# EAGLE schematic FRIDAY_Compute_SCH1 (EAGLE 9.6.2), part 1 of 2
Assembly variants: default

## Sheet 1 of 5: S1: Power Input (2S SY8205 + USB-C + TPS2121)
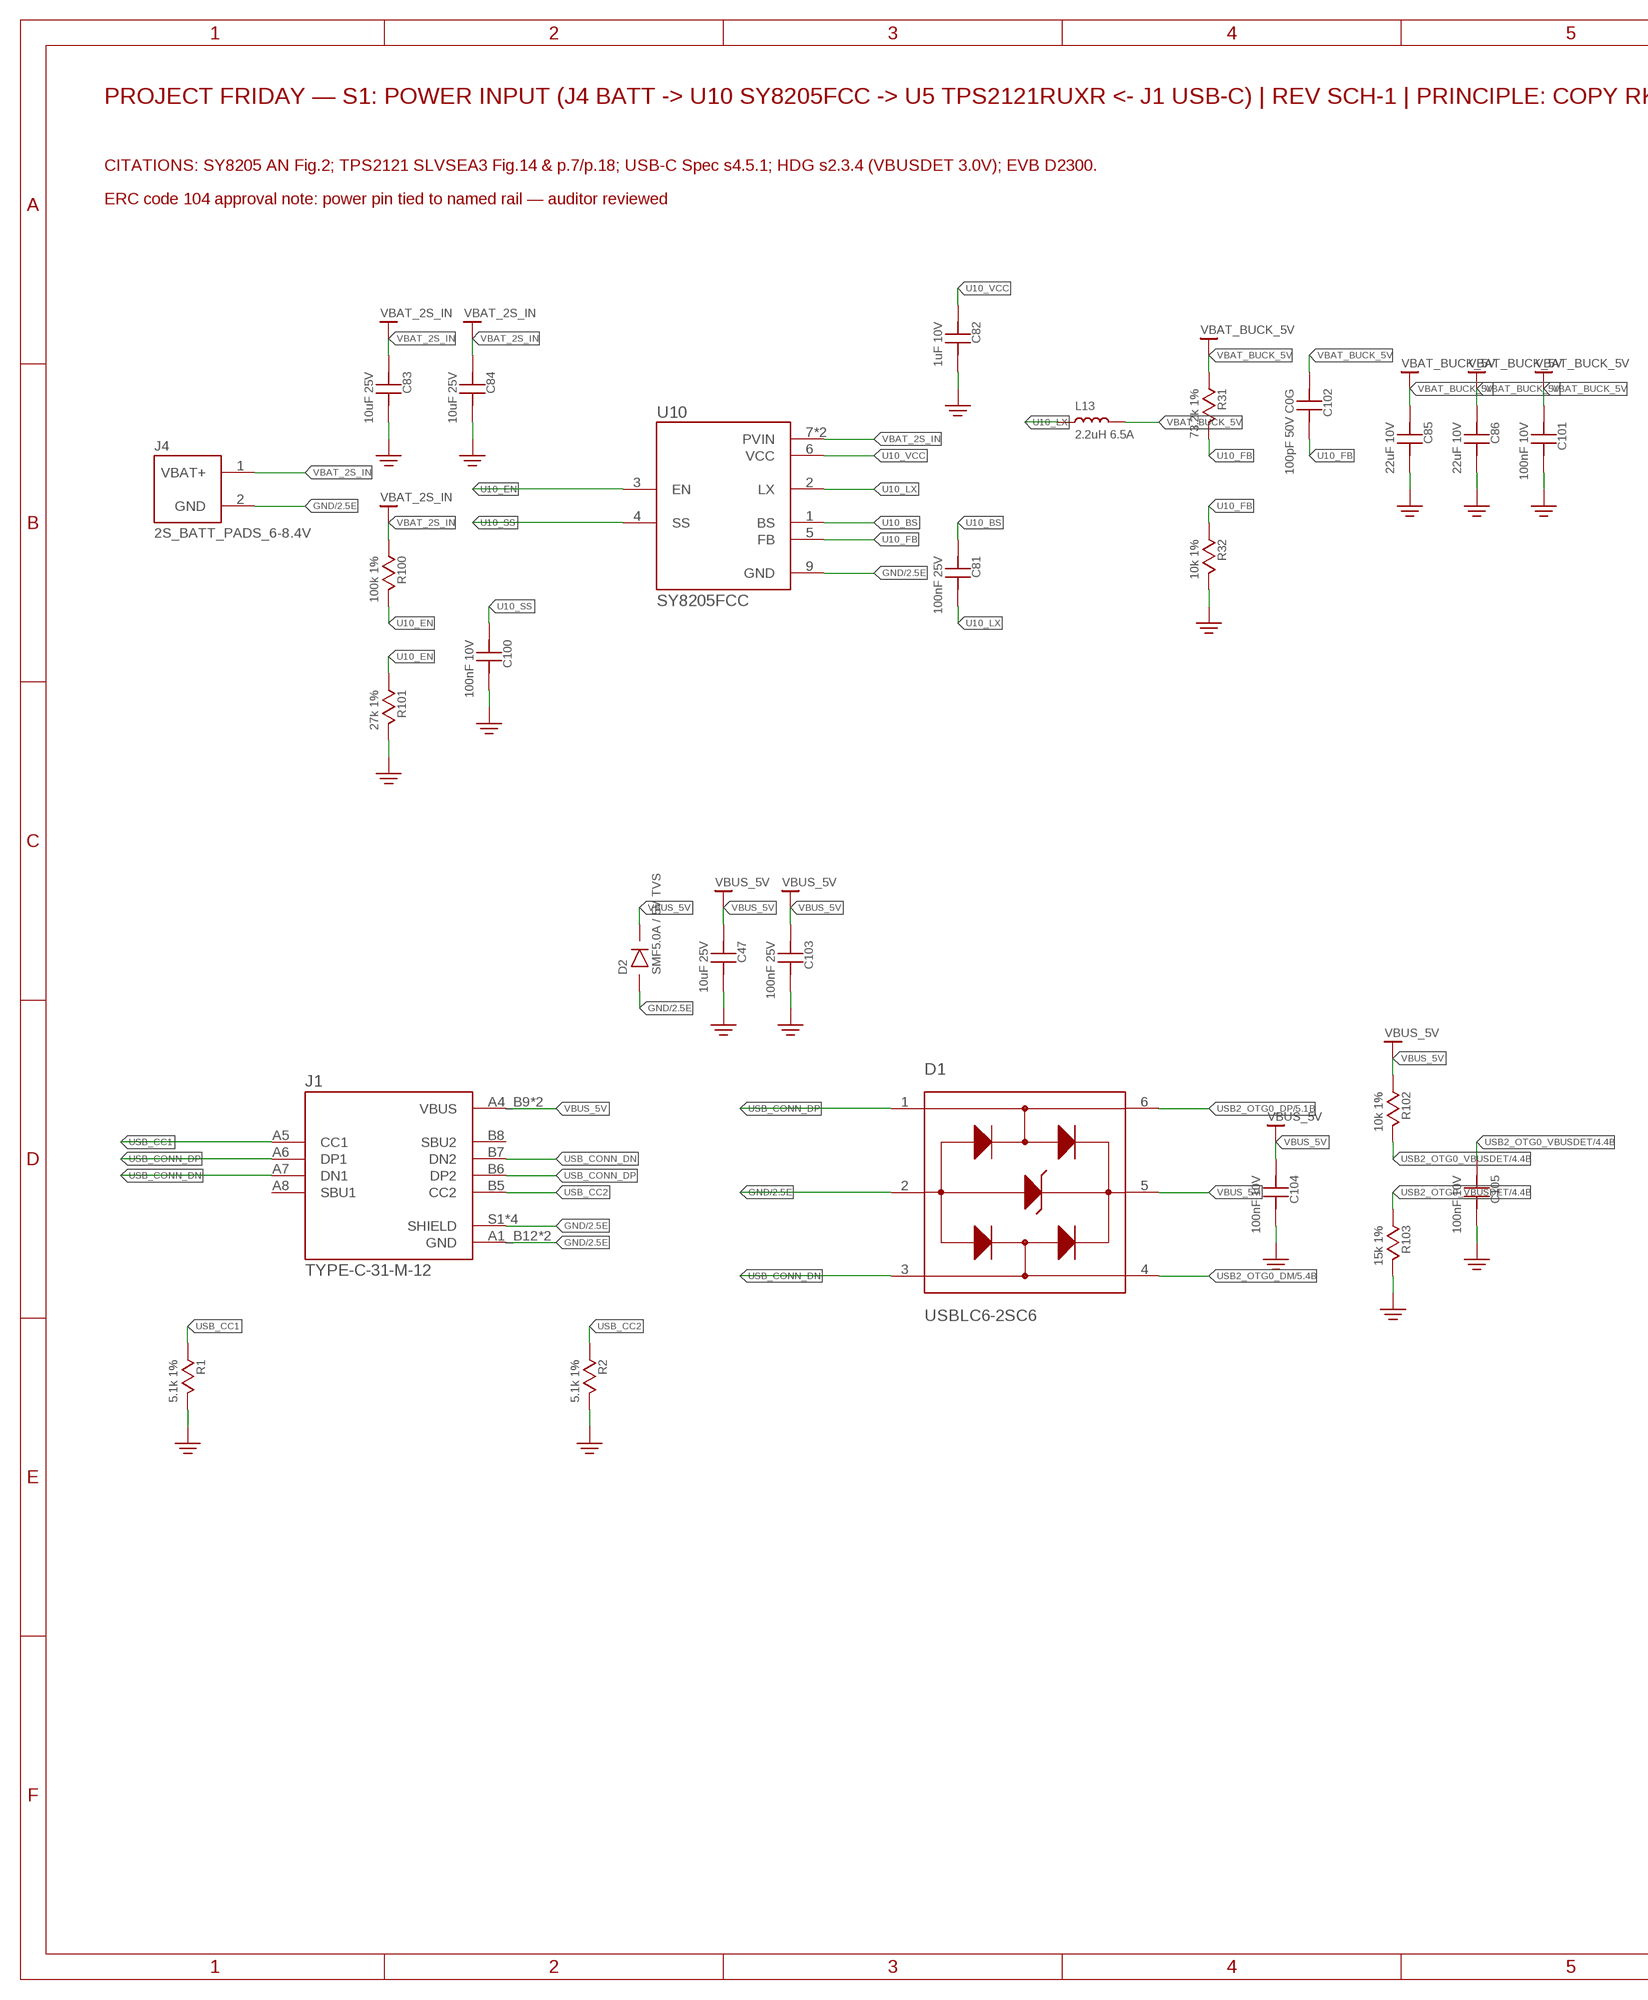
[diagram p0: schematic, sheet 1, part 1 of 2]
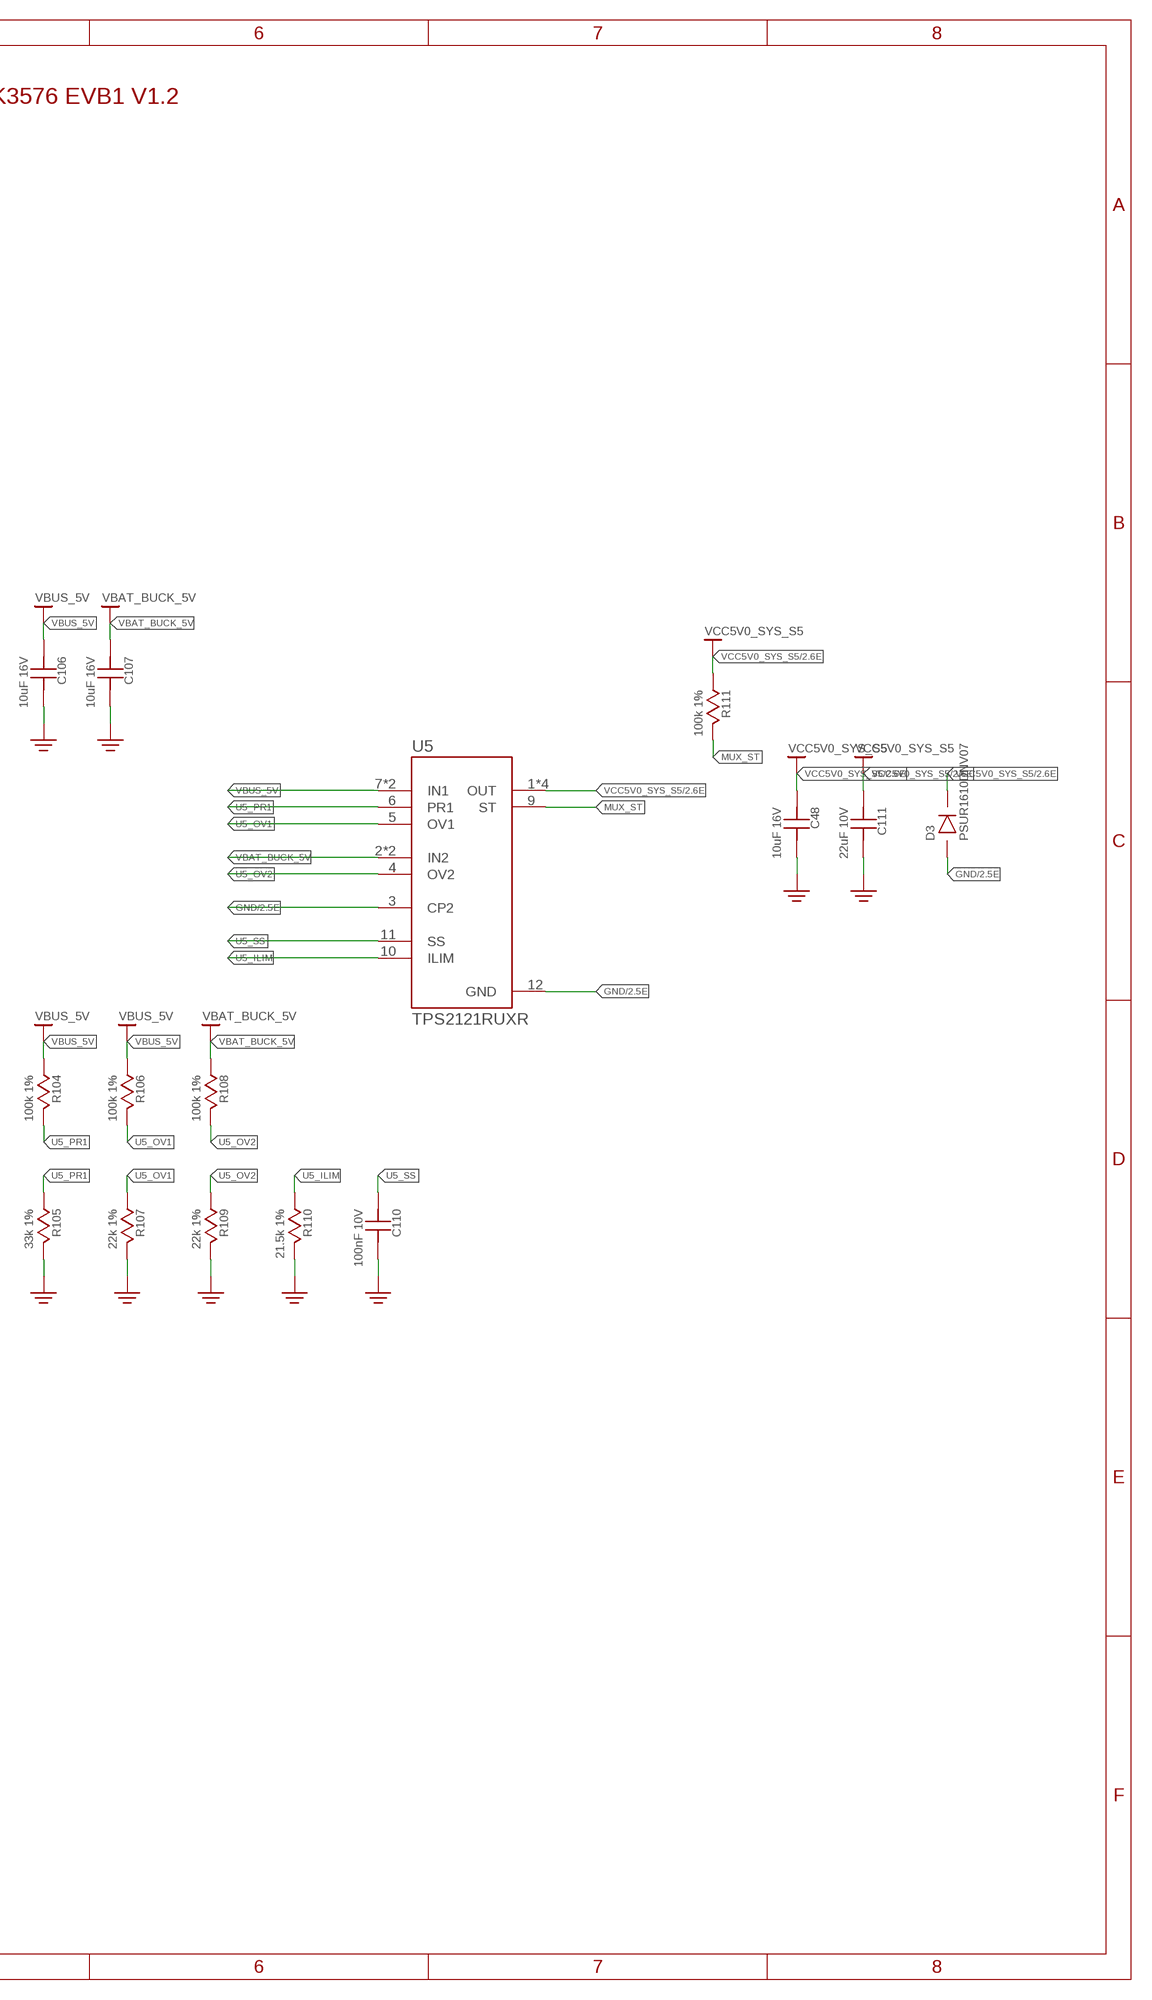
[diagram p1: schematic, sheet 1, part 2 of 2]

### Parts
C47  10uF 25V  C_0603  [C0603]
C48  10uF 16V  C_0603  [C0603]
C81  100nF 25V  C_0402  [C0402]
C82  1uF 10V  C_0402  [C0402]
C83  10uF 25V  C_0603  [C0603]
C84  10uF 25V  C_0603  [C0603]
C85  22uF 10V  C_0603  [C0603]
C86  22uF 10V  C_0603  [C0603]
C100  100nF 10V  C_0402  [C0402]
C101  100nF 10V  C_0402  [C0402]
C102  100pF 50V C0G  C_0402  [C0402]
C103  100nF 25V  C_0402  [C0402]
C104  100nF 10V  C_0402  [C0402]
C105  100nF 10V  C_0402  [C0402]
C106  10uF 16V  C_0603  [C0603]
C107  10uF 16V  C_0603  [C0603]
C110  100nF 10V  C_0402  [C0402]
C111  22uF 10V  C_0603  [C0603]
D1  USBLC6-2SC6  [SOT95P280X145-6N]
D2  SMF5.0A / 5V TVS  TVS_VBUS  [SOD-323]
D3  PSUR1610DNV07  [DFN1006-2]
J1  TYPE-C-31-M-12  [HRO_TYPE-C-31-M-12]
J4  2S_BATT_PADS_6-8.4V  BATT_PADS_2PIN  [BATT_PADS_2PIN]
L13  2.2uH 6.5A  IND_4040  [IND_4040]
PWR1  VBAT_2S_IN  (no package)
PWR3  VBAT_2S_IN  (no package)
PWR5  VBAT_2S_IN  (no package)
PWR9  VBAT_BUCK_5V  (no package)
PWR11  VBAT_BUCK_5V  (no package)
PWR13  VBAT_BUCK_5V  (no package)
PWR15  VBAT_BUCK_5V  (no package)
PWR19  VBUS_5V  (no package)
PWR21  VBUS_5V  (no package)
PWR23  VBUS_5V  (no package)
PWR25  VBUS_5V  (no package)
PWR28  VBUS_5V  (no package)
PWR30  VBAT_BUCK_5V  (no package)
PWR32  VBUS_5V  (no package)
PWR34  VBUS_5V  (no package)
PWR36  VBAT_BUCK_5V  (no package)
PWR40  VCC5V0_SYS_S5  (no package)
PWR41  VCC5V0_SYS_S5  (no package)
PWR43  VCC5V0_SYS_S5  (no package)
R1  5.1k 1%  R_0402  [R0402]
R2  5.1k 1%  R_0402  [R0402]
R31  73.2k 1%  R_0402  [R0402]
R32  10k 1%  R_0402  [R0402]
R100  100k 1%  R_0402  [R0402]
R101  27k 1%  R_0402  [R0402]
R102  10k 1%  R_0402  [R0402]
R103  15k 1%  R_0402  [R0402]
R104  100k 1%  R_0402  [R0402]
R105  33k 1%  R_0402  [R0402]
R106  100k 1%  R_0402  [R0402]
R107  22k 1%  R_0402  [R0402]
R108  100k 1%  R_0402  [R0402]
R109  22k 1%  R_0402  [R0402]
R110  21.5k 1%  R_0402  [R0402]
R111  100k 1%  R_0402  [R0402]
U5  TPS2121RUXR  [IC_TPS2121RUXR]
U10  SY8205FCC  [VREG_SY8205FCC]

### Nets
GND: C47.2 C48.2 C82.2 C83.2 C84.2 C85.2 C86.2 C100.2 C101.2 C103.2 C104.2 C105.2 C106.2 C107.2 C110.2 C111.2 D1.2(GND) D2.1 D3.1 J1.A1_B12(GND) J1.B1_A12(GND) J1.S1(SHIELD) J1.S2(SHIELD) J1.S3(SHIELD) J1.S4(SHIELD) J4.2(GND) R1.2 R2.2 R32.2 R101.2 R103.2 R105.2 R107.2 R109.2 R110.2 U5.3(CP2) U5.12(GND) U10.9(GND) ; also sheet 2,3,4,5
MUX_ST: R111.2 U5.9(ST)
U5_ILIM: R110.1 U5.10(ILIM)
U5_OV1: R106.2 R107.1 U5.5(OV1)
U5_OV2: R108.2 R109.1 U5.4(OV2)
U5_PR1: R104.2 R105.1 U5.6(PR1)
U5_SS: C110.1 U5.11(SS)
U10_BS: C81.1 U10.1(BS)
U10_EN: R100.2 R101.1 U10.3(EN)
U10_FB: C102.2 R31.2 R32.1 U10.5(FB)
U10_LX: C81.2 L13.1 U10.2(LX)
U10_SS: C100.1 U10.4(SS)
U10_VCC: C82.1 U10.6(VCC)
USB2_OTG0_DM: D1.4(I/O2_OUT) ; also sheet 5
USB2_OTG0_DP: D1.6(I/O1_OUT) ; also sheet 5
USB2_OTG0_VBUSDET: C105.1 R102.2 R103.1 ; also sheet 4
USB_CC1: J1.A5(CC1) R1.1
USB_CC2: J1.B5(CC2) R2.1
USB_CONN_DN: D1.3(I/O2_IN) J1.A7(DN1) J1.B7(DN2)
USB_CONN_DP: D1.1(I/O1_IN) J1.A6(DP1) J1.B6(DP2)
VBAT_2S_IN: C83.1 C84.1 J4.1(VBAT+) PWR1.VBAT_2S_IN PWR3.VBAT_2S_IN PWR5.VBAT_2S_IN R100.1 U10.7(PVIN) U10.8(PVIN)
VBAT_BUCK_5V: C85.1 C86.1 C101.1 C102.1 C107.1 L13.2 PWR9.VBAT_BUCK_5V PWR11.VBAT_BUCK_5V PWR13.VBAT_BUCK_5V PWR15.VBAT_BUCK_5V PWR30.VBAT_BUCK_5V PWR36.VBAT_BUCK_5V R31.1 R108.1 U5.2(IN2) U5.2_1(IN2)
VBUS_5V: C47.1 C103.1 C104.1 C106.1 D1.5(VBUS) D2.2 J1.A4_B9(VBUS) J1.B4_A9(VBUS) PWR19.VBUS_5V PWR21.VBUS_5V PWR23.VBUS_5V PWR25.VBUS_5V PWR28.VBUS_5V PWR32.VBUS_5V PWR34.VBUS_5V R102.1 R104.1 R106.1 U5.7(IN1) U5.7_1(IN1)
VCC5V0_SYS_S5: C48.1 C111.1 D3.2 PWR40.VCC5V0_SYS_S5 PWR41.VCC5V0_SYS_S5 PWR43.VCC5V0_SYS_S5 R111.1 U5.1(OUT) U5.1_1(OUT) U5.8(OUT) U5.8_1(OUT) ; also sheet 2,3
Unconnected: J1.A8(SBU1) J1.B8(SBU2)

### Notes on the sheet
- PROJECT FRIDAY — S1: POWER INPUT (J4 BATT -> U10 SY8205FCC -> U5 TPS2121RUXR <- J1 USB-C) | REV SCH-1 | PRINCIPLE: COPY RK3576 EVB1 V1.2
- CITATIONS: SY8205 AN Fig.2; TPS2121 SLVSEA3 Fig.14 & p.7/p.18; USB-C Spec s4.5.1; HDG s2.3.4 (VBUSDET 3.0V); EVB D2300.
- ERC code 104 approval note: power pin tied to named rail — auditor reviewed

## Sheet 2 of 5: S2: PMIC (U2 RK806S-5)
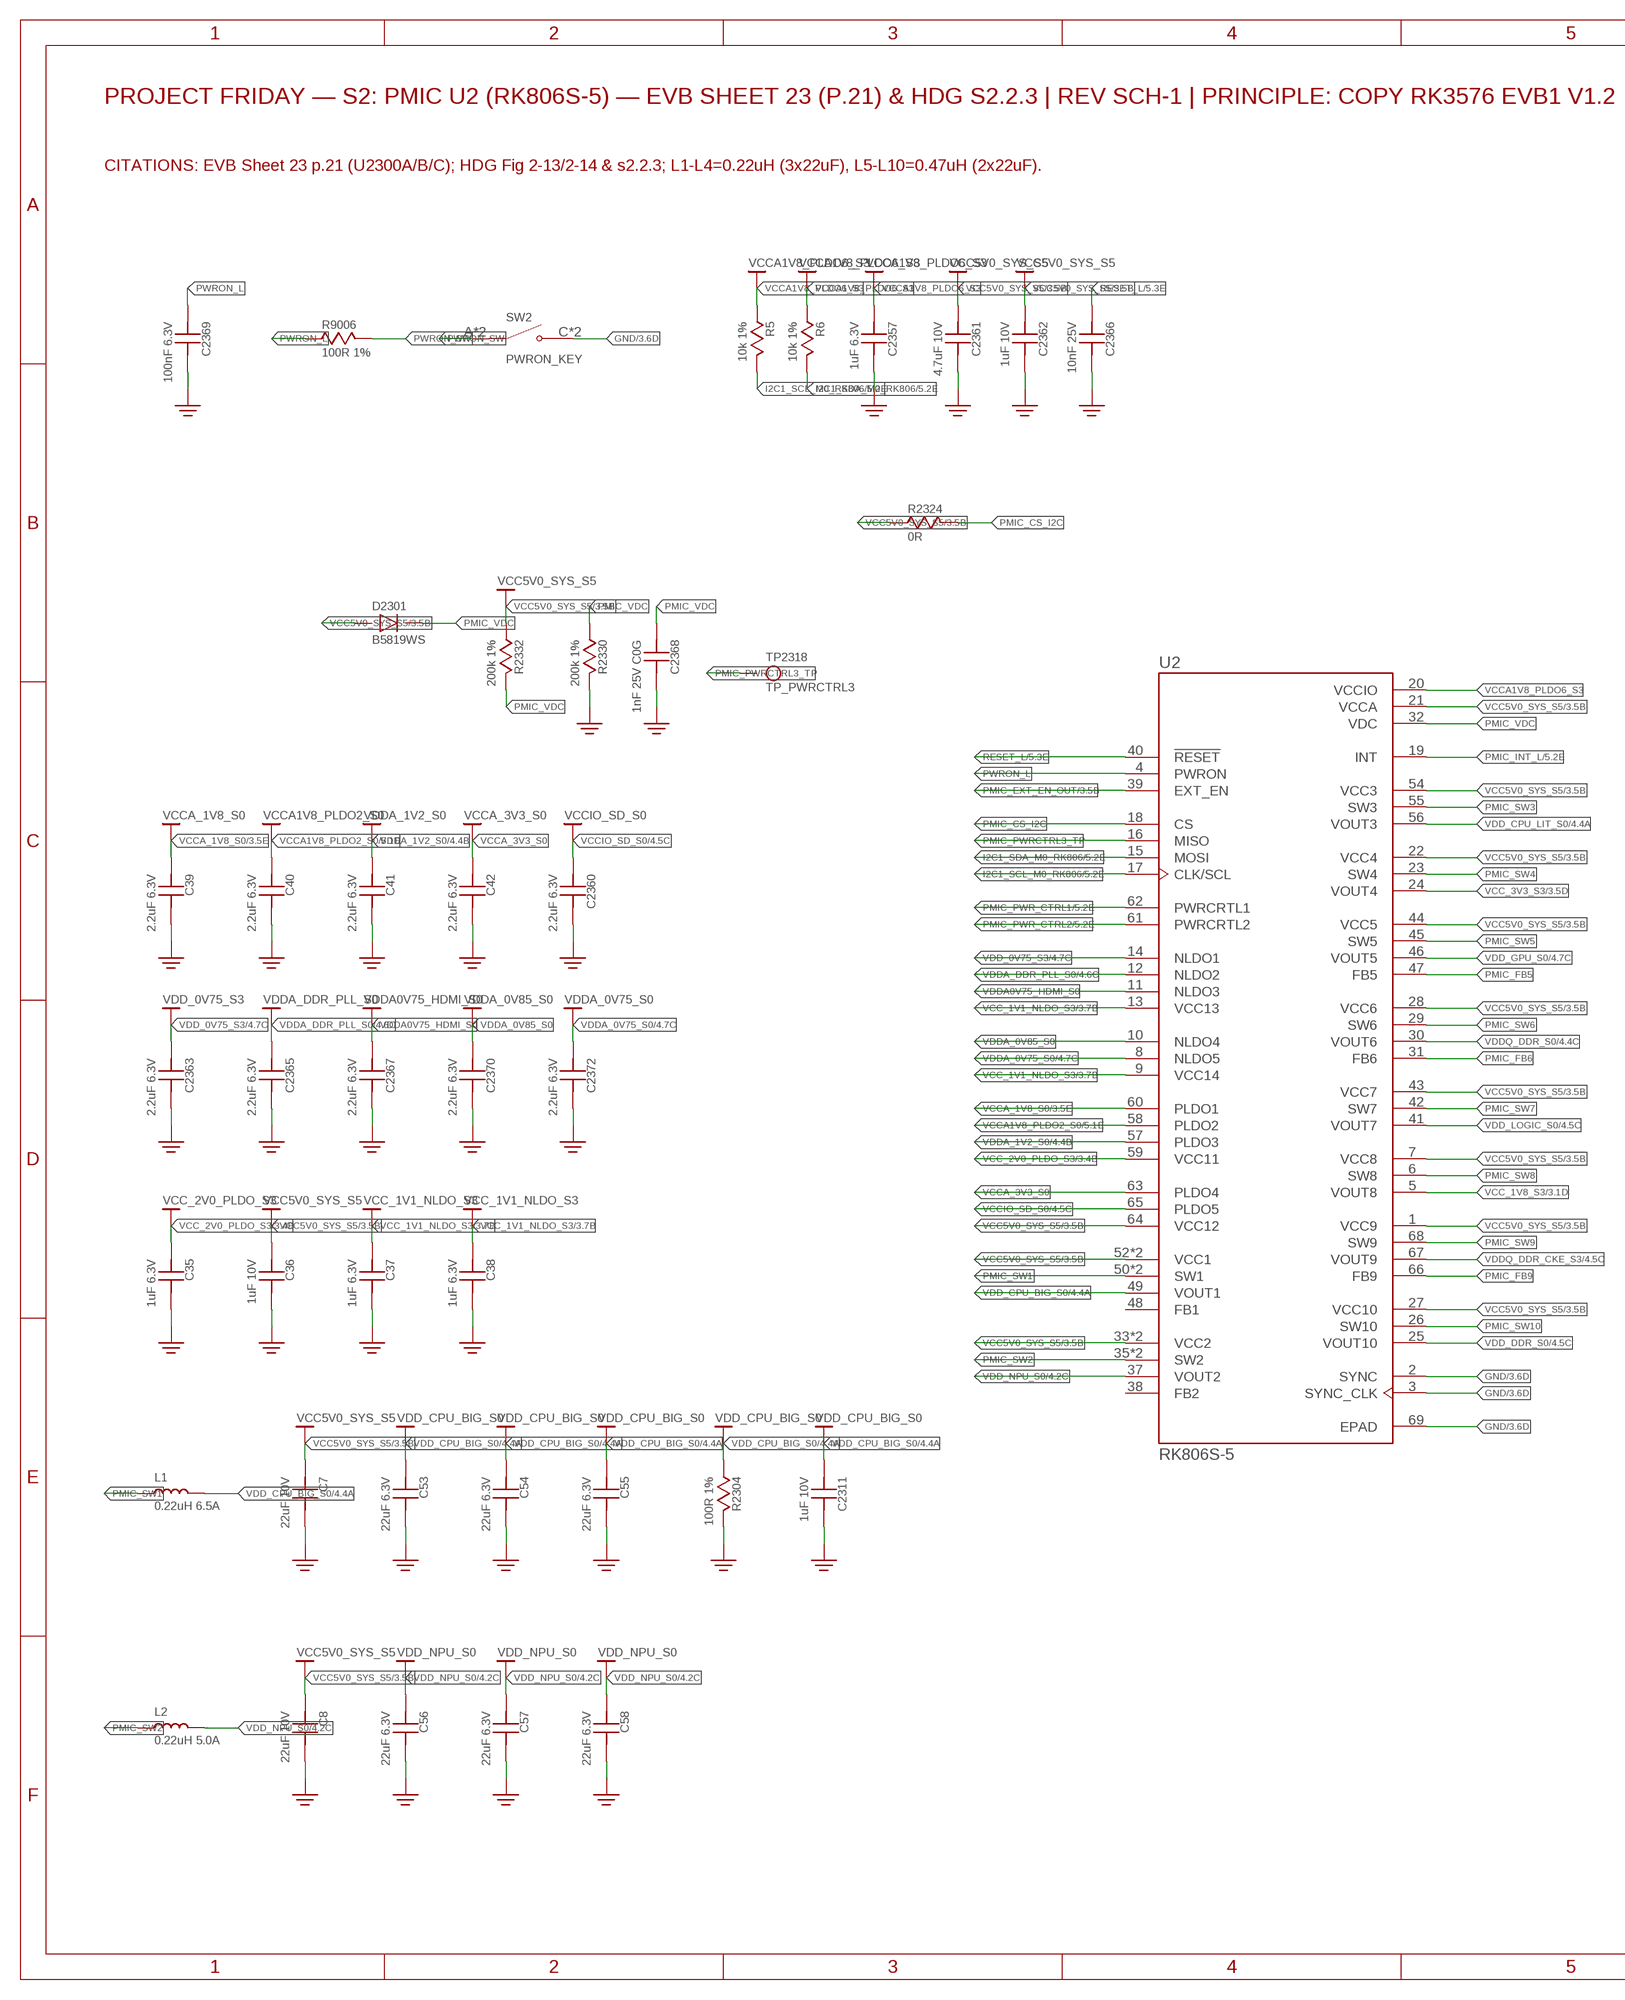
[diagram p2: schematic, sheet 2, part 1 of 2]
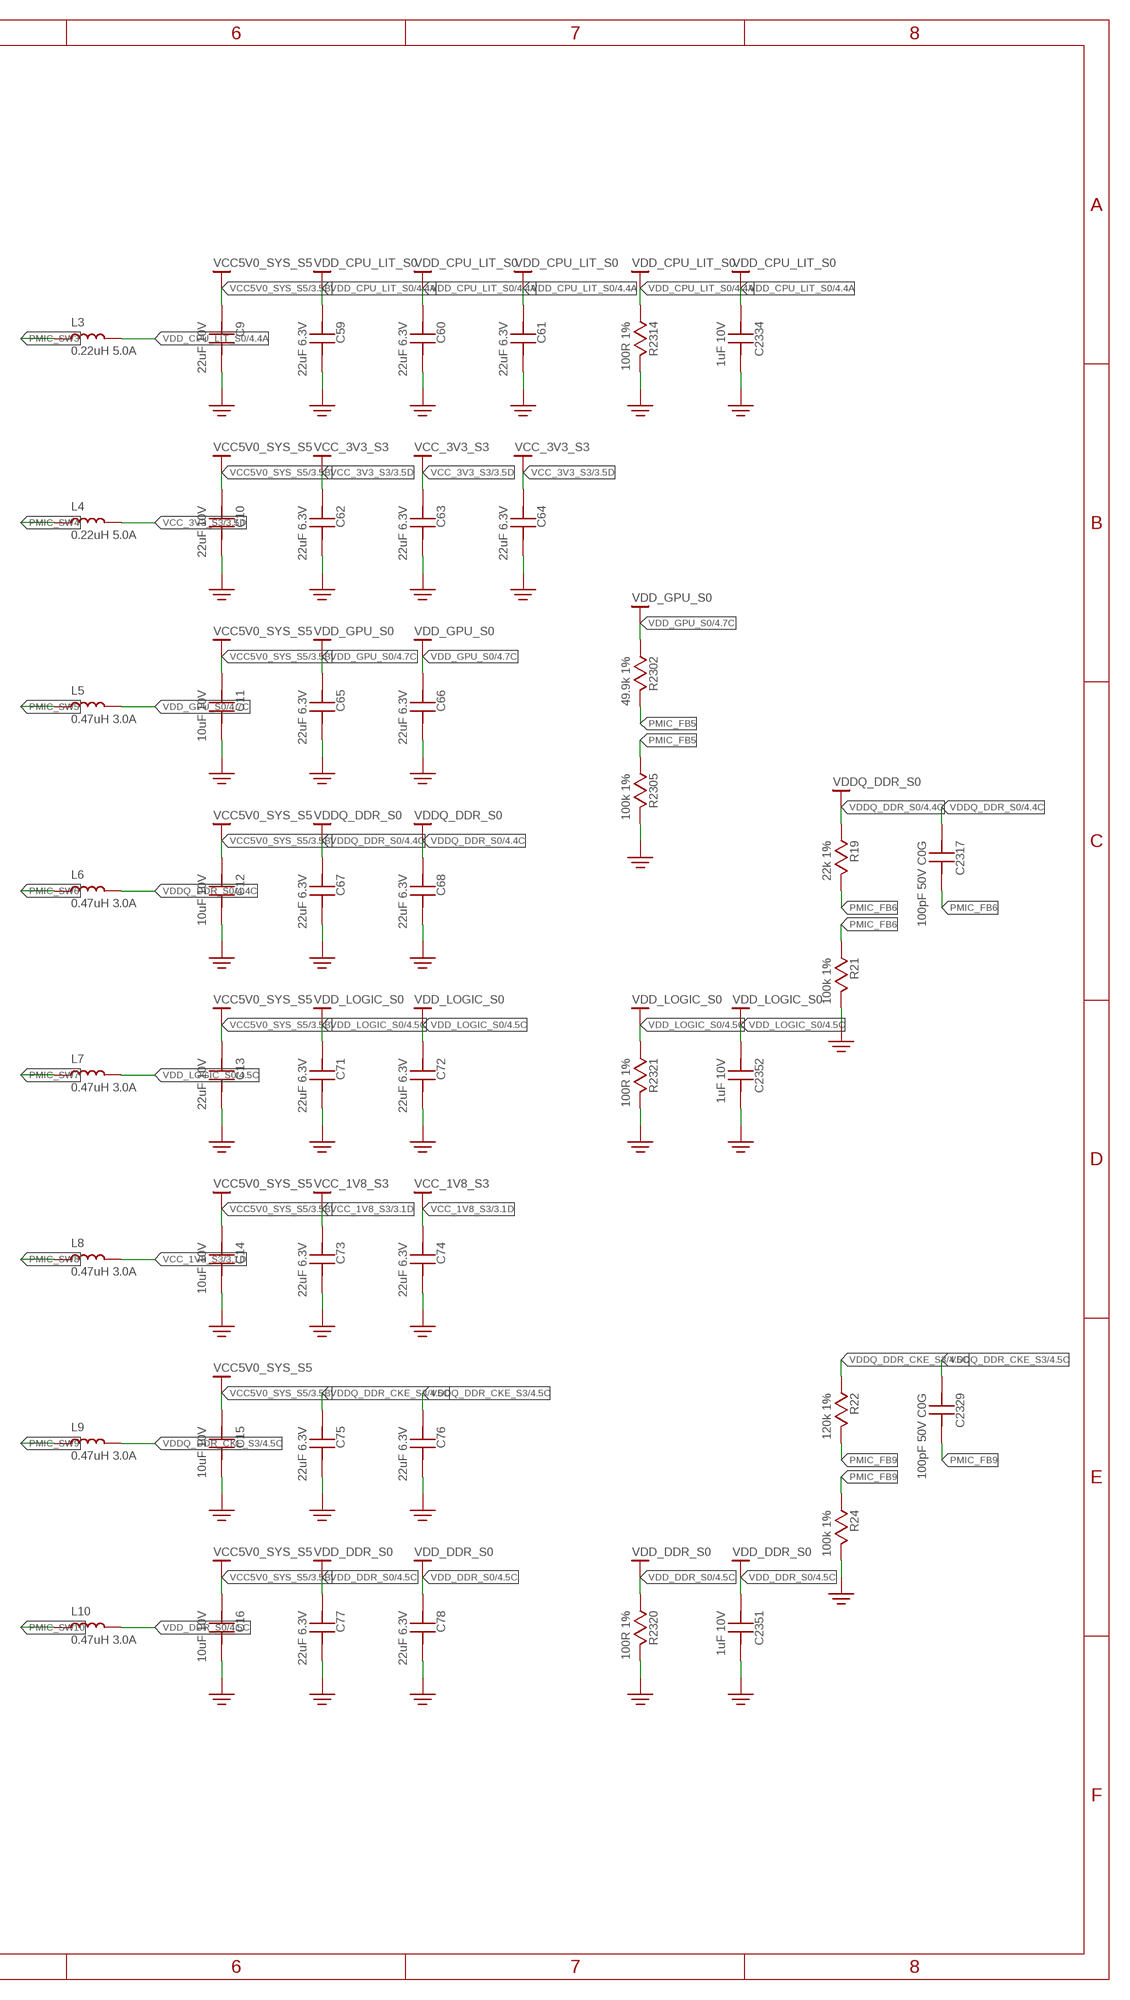
[diagram p3: schematic, sheet 2, part 2 of 2]

### Parts
C7  22uF 10V  C_0805  [C0805]
C8  22uF 10V  C_0805  [C0805]
C9  22uF 10V  C_0805  [C0805]
C10  22uF 10V  C_0805  [C0805]
C11  10uF 10V  C_0603  [C0603]
C12  10uF 10V  C_0603  [C0603]
C13  22uF 10V  C_0805  [C0805]
C14  10uF 10V  C_0603  [C0603]
C15  10uF 10V  C_0603  [C0603]
C16  10uF 10V  C_0603  [C0603]
C35  1uF 6.3V  C_0402  [C0402]
C36  1uF 10V  C_0402  [C0402]
C37  1uF 6.3V  C_0402  [C0402]
C38  1uF 6.3V  C_0402  [C0402]
C39  2.2uF 6.3V  C_0402  [C0402]
C40  2.2uF 6.3V  C_0402  [C0402]
C41  2.2uF 6.3V  C_0402  [C0402]
C42  2.2uF 6.3V  C_0402  [C0402]
C53  22uF 6.3V  C_0603  [C0603]
C54  22uF 6.3V  C_0603  [C0603]
C55  22uF 6.3V  C_0603  [C0603]
C56  22uF 6.3V  C_0603  [C0603]
C57  22uF 6.3V  C_0603  [C0603]
C58  22uF 6.3V  C_0603  [C0603]
C59  22uF 6.3V  C_0603  [C0603]
C60  22uF 6.3V  C_0603  [C0603]
C61  22uF 6.3V  C_0603  [C0603]
C62  22uF 6.3V  C_0603  [C0603]
C63  22uF 6.3V  C_0603  [C0603]
C64  22uF 6.3V  C_0603  [C0603]
C65  22uF 6.3V  C_0603  [C0603]
C66  22uF 6.3V  C_0603  [C0603]
C67  22uF 6.3V  C_0603  [C0603]
C68  22uF 6.3V  C_0603  [C0603]
C71  22uF 6.3V  C_0603  [C0603]
C72  22uF 6.3V  C_0603  [C0603]
C73  22uF 6.3V  C_0603  [C0603]
C74  22uF 6.3V  C_0603  [C0603]
C75  22uF 6.3V  C_0603  [C0603]
C76  22uF 6.3V  C_0603  [C0603]
C77  22uF 6.3V  C_0603  [C0603]
C78  22uF 6.3V  C_0603  [C0603]
C2311  1uF 10V  C_0402  [C0402]
C2317  100pF 50V C0G  C_0402  [C0402]
C2329  100pF 50V C0G  C_0402  [C0402]
C2334  1uF 10V  C_0402  [C0402]
C2351  1uF 10V  C_0402  [C0402]
C2352  1uF 10V  C_0402  [C0402]
C2357  1uF 6.3V  C_0402  [C0402]
C2360  2.2uF 6.3V  C_0402  [C0402]
C2361  4.7uF 10V  C_0402  [C0402]
C2362  1uF 10V  C_0402  [C0402]
C2363  2.2uF 6.3V  C_0402  [C0402]
C2365  2.2uF 6.3V  C_0402  [C0402]
C2366  10nF 25V  C_0402  [C0402]
C2367  2.2uF 6.3V  C_0402  [C0402]
C2368  1nF 25V C0G  C_0402  [C0402]
C2369  100nF 6.3V  C_0402  [C0402]
C2370  2.2uF 6.3V  C_0402  [C0402]
C2372  2.2uF 6.3V  C_0402  [C0402]
D2301  B5819WS  [SOD-323]
L1  0.22uH 6.5A  IND_2016  [IND_2016]
L2  0.22uH 5.0A  IND_2016  [IND_2016]
L3  0.22uH 5.0A  IND_2016  [IND_2016]
L4  0.22uH 5.0A  IND_2016  [IND_2016]
L5  0.47uH 3.0A  IND_2016  [IND_2016]
L6  0.47uH 3.0A  IND_2016  [IND_2016]
L7  0.47uH 3.0A  IND_2016  [IND_2016]
L8  0.47uH 3.0A  IND_2016  [IND_2016]
L9  0.47uH 3.0A  IND_2016  [IND_2016]
L10  0.47uH 3.0A  IND_2016  [IND_2016]
PWR45  VCC5V0_SYS_S5  (no package)
PWR47  VDD_CPU_BIG_S0  (no package)
PWR49  VDD_CPU_BIG_S0  (no package)
PWR51  VDD_CPU_BIG_S0  (no package)
PWR53  VDD_CPU_BIG_S0  (no package)
PWR55  VDD_CPU_BIG_S0  (no package)
PWR57  VCC5V0_SYS_S5  (no package)
PWR59  VDD_NPU_S0  (no package)
PWR61  VDD_NPU_S0  (no package)
PWR63  VDD_NPU_S0  (no package)
PWR65  VCC5V0_SYS_S5  (no package)
PWR67  VDD_CPU_LIT_S0  (no package)
PWR69  VDD_CPU_LIT_S0  (no package)
PWR71  VDD_CPU_LIT_S0  (no package)
PWR73  VDD_CPU_LIT_S0  (no package)
PWR75  VDD_CPU_LIT_S0  (no package)
PWR77  VCC5V0_SYS_S5  (no package)
PWR79  VCC_3V3_S3  (no package)
PWR81  VCC_3V3_S3  (no package)
PWR83  VCC_3V3_S3  (no package)
PWR85  VCC5V0_SYS_S5  (no package)
PWR87  VDD_GPU_S0  (no package)
PWR89  VDD_GPU_S0  (no package)
PWR91  VDD_GPU_S0  (no package)
PWR93  VCC5V0_SYS_S5  (no package)
PWR95  VDDQ_DDR_S0  (no package)
PWR97  VDDQ_DDR_S0  (no package)
PWR99  VDDQ_DDR_S0  (no package)
PWR101  VCC5V0_SYS_S5  (no package)
PWR103  VDD_LOGIC_S0  (no package)
PWR105  VDD_LOGIC_S0  (no package)
PWR107  VDD_LOGIC_S0  (no package)
PWR109  VDD_LOGIC_S0  (no package)
PWR111  VCC5V0_SYS_S5  (no package)
PWR113  VCC_1V8_S3  (no package)
PWR115  VCC_1V8_S3  (no package)
PWR117  VCC5V0_SYS_S5  (no package)
PWR125  VCC5V0_SYS_S5  (no package)
PWR127  VDD_DDR_S0  (no package)
PWR129  VDD_DDR_S0  (no package)
PWR131  VDD_DDR_S0  (no package)
PWR133  VDD_DDR_S0  (no package)
PWR135  VCC_2V0_PLDO_S3  (no package)
PWR137  VCC5V0_SYS_S5  (no package)
PWR139  VCC_1V1_NLDO_S3  (no package)
PWR141  VCC_1V1_NLDO_S3  (no package)
PWR143  VCCA_1V8_S0  (no package)
PWR145  VCCA1V8_PLDO2_S0  (no package)
PWR147  VDDA_1V2_S0  (no package)
PWR149  VCCA_3V3_S0  (no package)
PWR151  VCCIO_SD_S0  (no package)
PWR153  VDD_0V75_S3  (no package)
PWR155  VDDA_DDR_PLL_S0  (no package)
PWR157  VDDA0V75_HDMI_S0  (no package)
PWR159  VDDA_0V85_S0  (no package)
PWR161  VDDA_0V75_S0  (no package)
PWR163  VCCA1V8_PLDO6_S3  (no package)
PWR165  VCC5V0_SYS_S5  (no package)
PWR167  VCC5V0_SYS_S5  (no package)
PWR169  VCCA1V8_PLDO6_S3  (no package)
PWR170  VCCA1V8_PLDO6_S3  (no package)
PWR173  VCC5V0_SYS_S5  (no package)
R5  10k 1%  R_0402  [R0402]
R6  10k 1%  R_0402  [R0402]
R19  22k 1%  R_0402  [R0402]
R21  100k 1%  R_0402  [R0402]
R22  120k 1%  R_0402  [R0402]
R24  100k 1%  R_0402  [R0402]
R2302  49.9k 1%  R_0402  [R0402]
R2304  100R 1%  R_0402  [R0402]
R2305  100k 1%  R_0402  [R0402]
R2314  100R 1%  R_0402  [R0402]
R2320  100R 1%  R_0402  [R0402]
R2321  100R 1%  R_0402  [R0402]
R2324  0R  R_0402  [R0402]
R2330  200k 1%  R_0402  [R0402]
R2332  200k 1%  R_0402  [R0402]
R9006  100R 1%  R_0402  [R0402]
SW2  PWRON_KEY  TS-1187A-B-A-B  [SW_TS-1187A-B-A-B]
TP2318  TP_PWRCTRL3  TP_1MM  [TP_1MM]
U2  RK806S-5  RK806-1  [QFN35P700X700X90-69N]

### Nets
GND: C7.2 C8.2 C9.2 C10.2 C11.2 C12.2 C13.2 C14.2 C15.2 C16.2 C35.2 C36.2 C37.2 C38.2 C39.2 C40.2 C41.2 C42.2 C53.2 C54.2 C55.2 C56.2 C57.2 C58.2 C59.2 C60.2 C61.2 C62.2 C63.2 C64.2 C65.2 C66.2 C67.2 C68.2 C71.2 C72.2 C73.2 C74.2 C75.2 C76.2 C77.2 C78.2 C2311.2 C2334.2 C2351.2 C2352.2 C2357.2 C2360.2 C2361.2 C2362.2 C2363.2 C2365.2 C2366.2 C2367.2 C2368.2 C2369.2 C2370.2 C2372.2 R21.2 R24.2 R2304.2 R2305.2 R2314.2 R2320.2 R2321.2 R2330.2 SW2.C(NO) SW2.D(NO) U2.2(SYNC) U2.3(SYNC_CLK) U2.69(EPAD) ; also sheet 1,3,4,5
I2C1_SCL_M0_RK806: R5.2 U2.17(CLK/SCL) ; also sheet 5
I2C1_SDA_M0_RK806: R6.2 U2.15(MOSI) ; also sheet 5
PMIC_CS_I2C: R2324.2 U2.18(CS)
PMIC_EXT_EN_OUT: U2.39(EXT_EN) ; also sheet 3
PMIC_FB5: R2302.2 R2305.1 U2.47(FB5)
PMIC_FB6: C2317.2 R19.2 R21.1 U2.31(FB6)
PMIC_FB9: C2329.2 R22.2 R24.1 U2.66(FB9)
PMIC_INT_L: U2.19(INT) ; also sheet 5
PMIC_PWR_CTRL1: U2.62(PWRCRTL1) ; also sheet 5
PMIC_PWR_CTRL2: U2.61(PWRCRTL2) ; also sheet 5
PMIC_PWRCTRL3_TP: TP2318.1 U2.16(MISO)
PMIC_SW1: L1.1 U2.50(SW1) U2.51(SW1)
PMIC_SW2: L2.1 U2.35(SW2) U2.36(SW2)
PMIC_SW3: L3.1 U2.55(SW3)
PMIC_SW4: L4.1 U2.23(SW4)
PMIC_SW5: L5.1 U2.45(SW5)
PMIC_SW6: L6.1 U2.29(SW6)
PMIC_SW7: L7.1 U2.42(SW7)
PMIC_SW8: L8.1 U2.6(SW8)
PMIC_SW9: L9.1 U2.68(SW9)
PMIC_SW10: L10.1 U2.26(SW10)
PMIC_VDC: C2368.1 D2301.2 R2330.1 R2332.2 U2.32(VDC)
PWRON_L: C2369.1 R9006.1 U2.4(PWRON)
PWRON_SW: R9006.2 SW2.A(COM) SW2.B(COM)
RESET_L: C2366.1 U2.40(!RESET) ; also sheet 5
VCC5V0_SYS_S5: C7.1 C8.1 C9.1 C10.1 C11.1 C12.1 C13.1 C14.1 C15.1 C16.1 C36.1 C2361.1 C2362.1 D2301.1 PWR45.VCC5V0_SYS_S5 PWR57.VCC5V0_SYS_S5 PWR65.VCC5V0_SYS_S5 PWR77.VCC5V0_SYS_S5 PWR85.VCC5V0_SYS_S5 PWR93.VCC5V0_SYS_S5 PWR101.VCC5V0_SYS_S5 PWR111.VCC5V0_SYS_S5 PWR117.VCC5V0_SYS_S5 PWR125.VCC5V0_SYS_S5 PWR137.VCC5V0_SYS_S5 PWR165.VCC5V0_SYS_S5 PWR167.VCC5V0_SYS_S5 PWR173.VCC5V0_SYS_S5 R2324.1 R2332.1 U2.1(VCC9) U2.7(VCC8) U2.21(VCCA) U2.22(VCC4) U2.27(VCC10) U2.28(VCC6) U2.33(VCC2) U2.34(VCC2) U2.43(VCC7) U2.44(VCC5) U2.52(VCC1) U2.53(VCC1) U2.54(VCC3) U2.64(VCC12) ; also sheet 1,3
VCC_1V1_NLDO_S3: C37.1 C38.1 PWR139.VCC_1V1_NLDO_S3 PWR141.VCC_1V1_NLDO_S3 U2.9(VCC14) U2.13(VCC13) ; also sheet 3
VCC_1V8_S3: C73.1 C74.1 L8.2 PWR113.VCC_1V8_S3 PWR115.VCC_1V8_S3 U2.5(VOUT8) ; also sheet 3,4,5
VCC_2V0_PLDO_S3: C35.1 PWR135.VCC_2V0_PLDO_S3 U2.59(VCC11) ; also sheet 3
VCC_3V3_S3: C62.1 C63.1 C64.1 L4.2 PWR79.VCC_3V3_S3 PWR81.VCC_3V3_S3 PWR83.VCC_3V3_S3 U2.24(VOUT4) ; also sheet 3,4,5
VCCA1V8_PLDO2_S0: C40.1 PWR145.VCCA1V8_PLDO2_S0 U2.58(PLDO2) ; also sheet 5
VCCA1V8_PLDO6_S3: C2357.1 PWR163.VCCA1V8_PLDO6_S3 PWR169.VCCA1V8_PLDO6_S3 PWR170.VCCA1V8_PLDO6_S3 R5.1 R6.1 U2.20(VCCIO)
VCCA_1V8_S0: C39.1 PWR143.VCCA_1V8_S0 U2.60(PLDO1) ; also sheet 3,4,5
VCCA_3V3_S0: C42.1 PWR149.VCCA_3V3_S0 U2.63(PLDO4)
VCCIO_SD_S0: C2360.1 PWR151.VCCIO_SD_S0 U2.65(PLDO5) ; also sheet 4
VDD_0V75_S3: C2363.1 PWR153.VDD_0V75_S3 U2.14(NLDO1) ; also sheet 4
VDD_CPU_BIG_S0: C53.1 C54.1 C55.1 C2311.1 L1.2 PWR47.VDD_CPU_BIG_S0 PWR49.VDD_CPU_BIG_S0 PWR51.VDD_CPU_BIG_S0 PWR53.VDD_CPU_BIG_S0 PWR55.VDD_CPU_BIG_S0 R2304.1 U2.49(VOUT1) ; also sheet 4
VDD_CPU_LIT_S0: C59.1 C60.1 C61.1 C2334.1 L3.2 PWR67.VDD_CPU_LIT_S0 PWR69.VDD_CPU_LIT_S0 PWR71.VDD_CPU_LIT_S0 PWR73.VDD_CPU_LIT_S0 PWR75.VDD_CPU_LIT_S0 R2314.1 U2.56(VOUT3) ; also sheet 4
VDD_DDR_S0: C77.1 C78.1 C2351.1 L10.2 PWR127.VDD_DDR_S0 PWR129.VDD_DDR_S0 PWR131.VDD_DDR_S0 PWR133.VDD_DDR_S0 R2320.1 U2.25(VOUT10) ; also sheet 4
VDD_GPU_S0: C65.1 C66.1 L5.2 PWR87.VDD_GPU_S0 PWR89.VDD_GPU_S0 PWR91.VDD_GPU_S0 R2302.1 U2.46(VOUT5) ; also sheet 4
VDD_LOGIC_S0: C71.1 C72.1 C2352.1 L7.2 PWR103.VDD_LOGIC_S0 PWR105.VDD_LOGIC_S0 PWR107.VDD_LOGIC_S0 PWR109.VDD_LOGIC_S0 R2321.1 U2.41(VOUT7) ; also sheet 4
VDD_NPU_S0: C56.1 C57.1 C58.1 L2.2 PWR59.VDD_NPU_S0 PWR61.VDD_NPU_S0 PWR63.VDD_NPU_S0 U2.37(VOUT2) ; also sheet 4
VDDA0V75_HDMI_S0: C2367.1 PWR157.VDDA0V75_HDMI_S0 U2.11(NLDO3)
VDDA_0V75_S0: C2372.1 PWR161.VDDA_0V75_S0 U2.8(NLDO5) ; also sheet 4
VDDA_0V85_S0: C2370.1 PWR159.VDDA_0V85_S0 U2.10(NLDO4) ; also sheet 4
VDDA_1V2_S0: C41.1 PWR147.VDDA_1V2_S0 U2.57(PLDO3) ; also sheet 4
VDDA_DDR_PLL_S0: C2365.1 PWR155.VDDA_DDR_PLL_S0 U2.12(NLDO2) ; also sheet 4
VDDQ_DDR_CKE_S3: C75.1 C76.1 C2329.1 L9.2 R22.1 U2.67(VOUT9) ; also sheet 4
VDDQ_DDR_S0: C67.1 C68.1 C2317.1 L6.2 PWR95.VDDQ_DDR_S0 PWR97.VDDQ_DDR_S0 PWR99.VDDQ_DDR_S0 R19.1 U2.30(VOUT6) ; also sheet 4
Unconnected: U2.38(FB2) U2.48(FB1)

### Notes on the sheet
- PROJECT FRIDAY — S2: PMIC U2 (RK806S-5) — EVB SHEET 23 (P.21) & HDG S2.2.3 | REV SCH-1 | PRINCIPLE: COPY RK3576 EVB1 V1.2
- CITATIONS: EVB Sheet 23 p.21 (U2300A/B/C); HDG Fig 2-13/2-14 & s2.2.3; L1-L4=0.22uH (3x22uF), L5-L10=0.47uH (2x22uF).

## Sheet 3 of 5: S3: Discrete Power (U6/U7 TMI3112H, U8 SY6280, U9 CW3301)
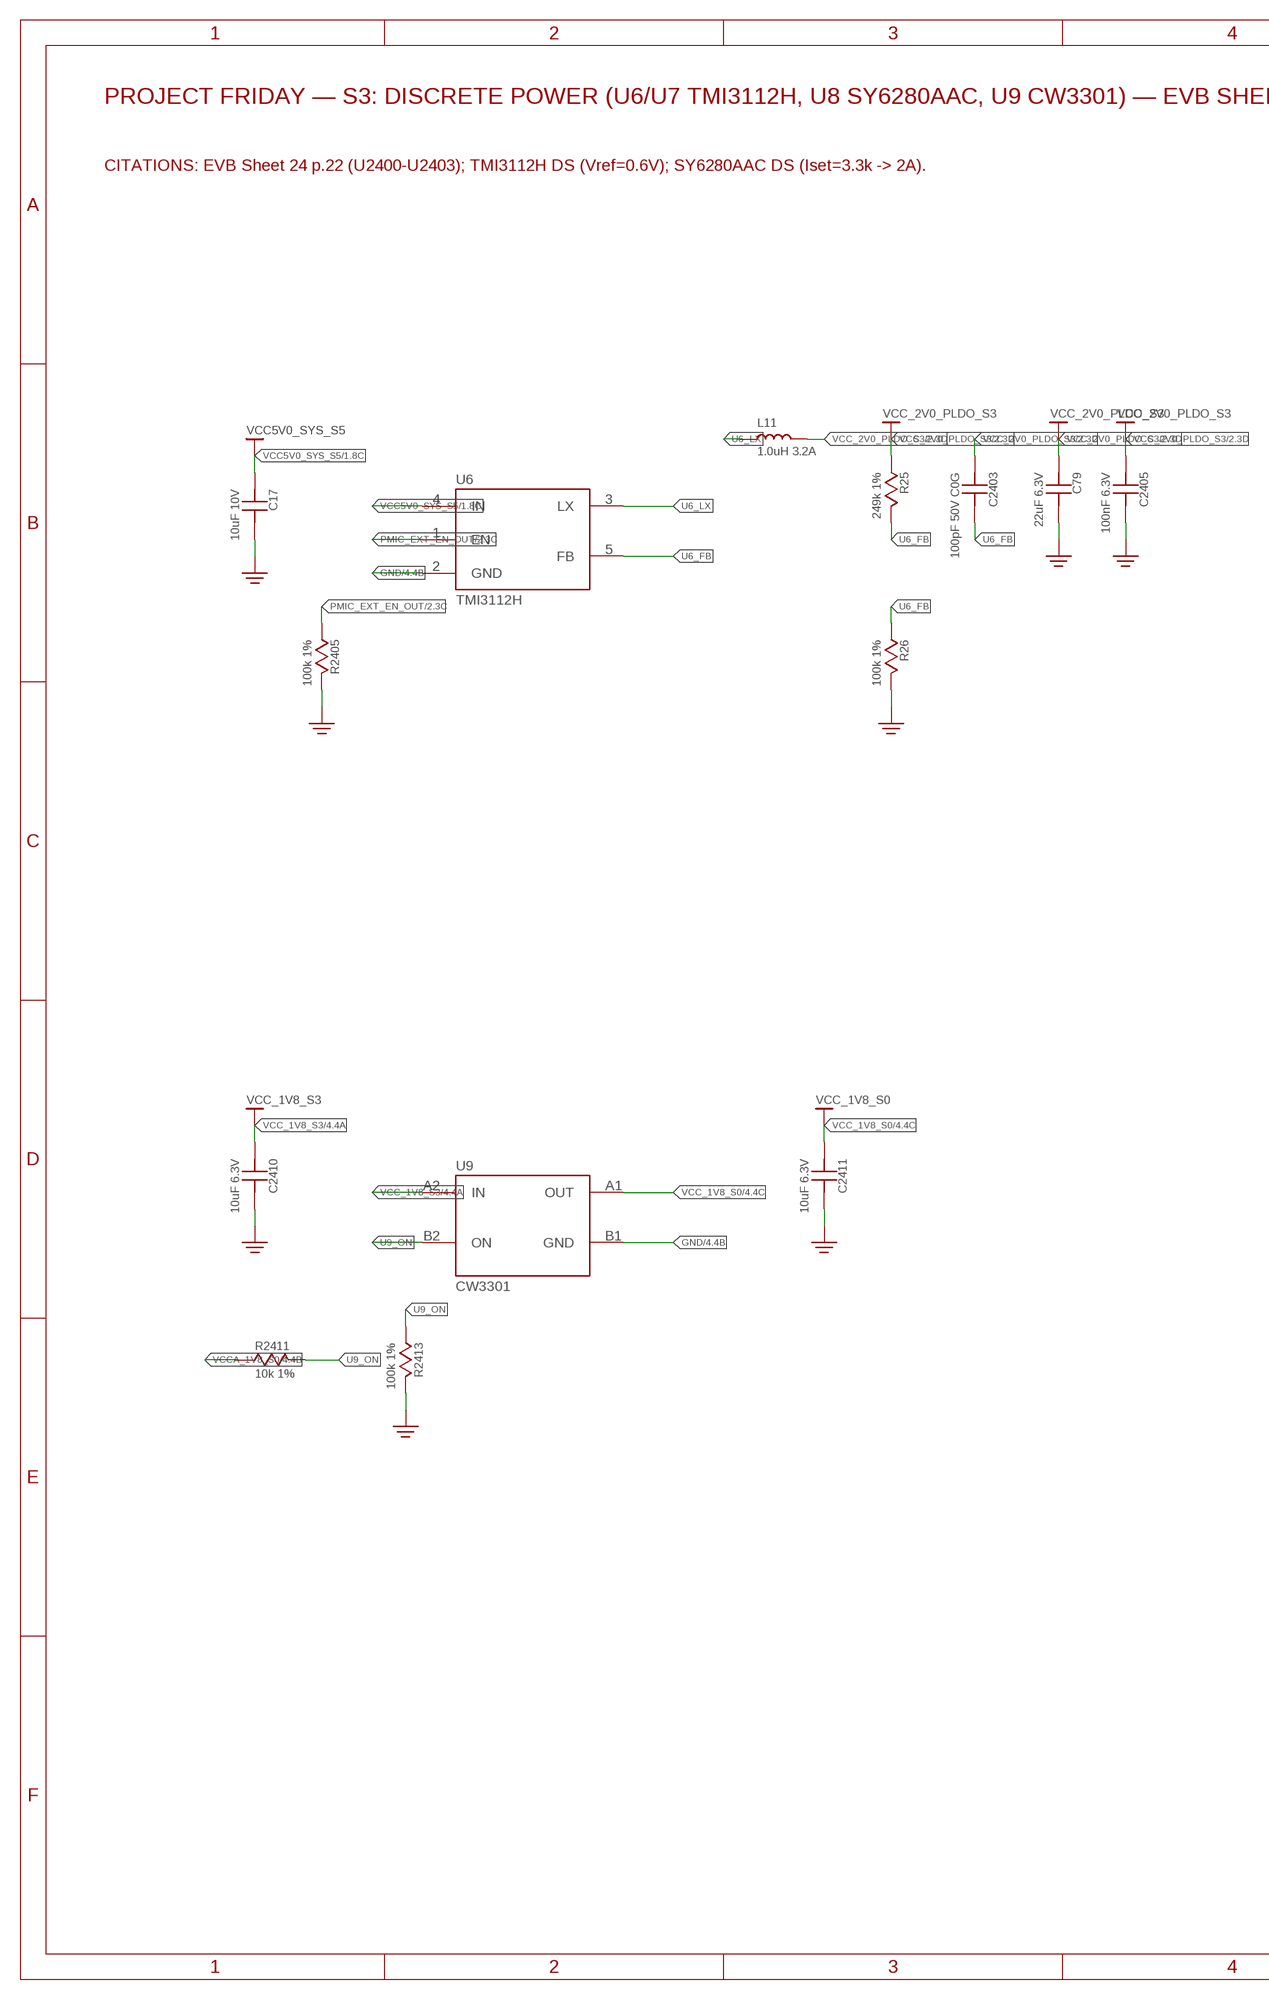
[diagram p4: schematic, sheet 3, part 1 of 2]
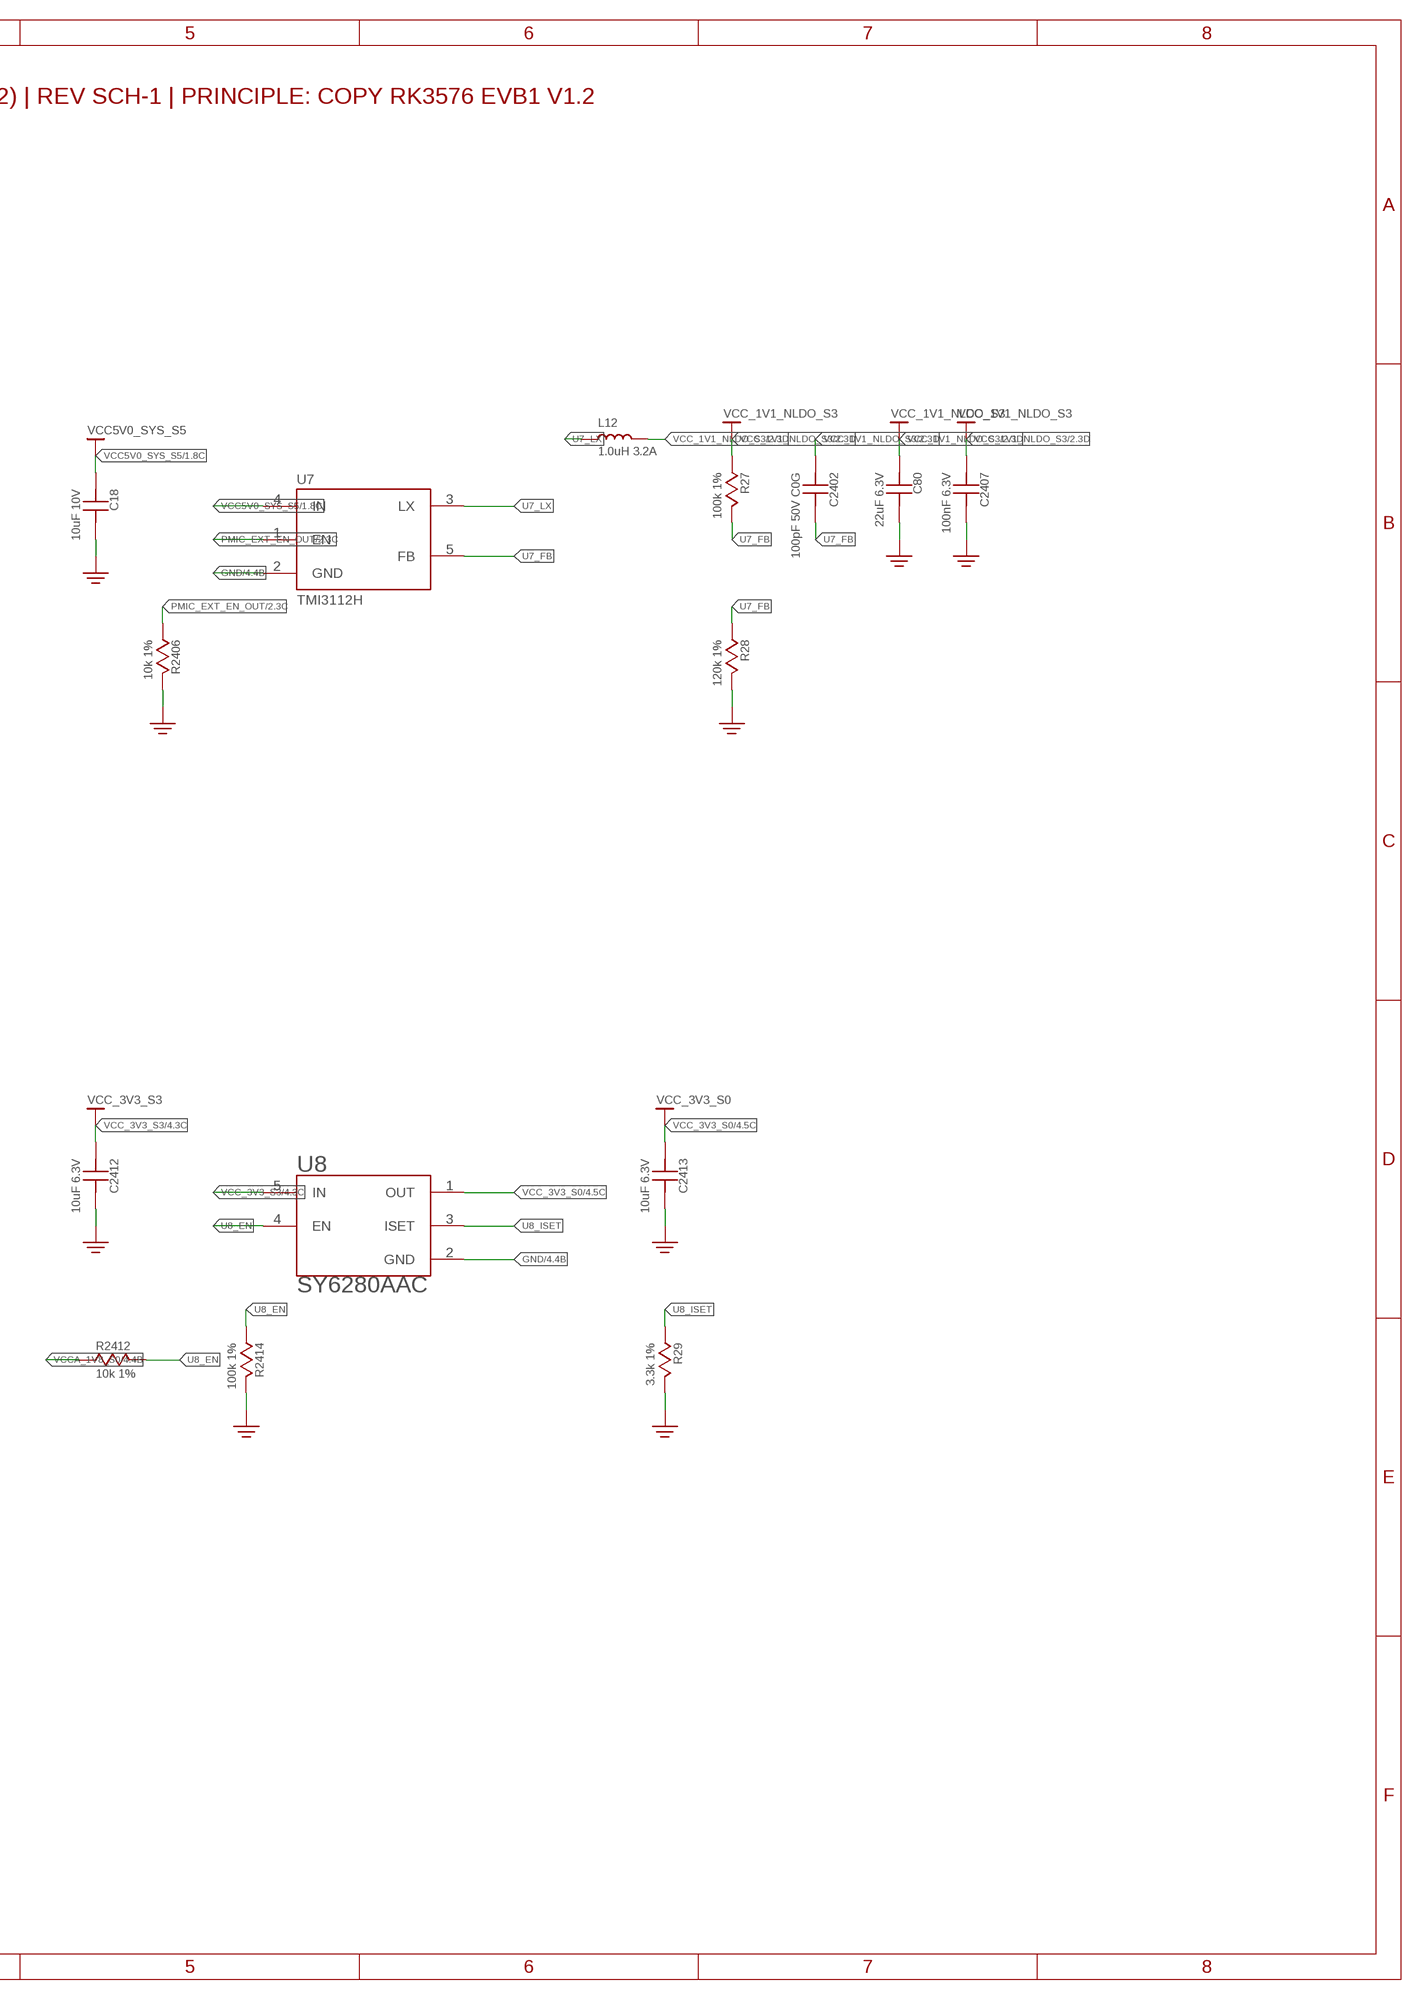
[diagram p5: schematic, sheet 3, part 2 of 2]

### Parts
C17  10uF 10V  C_0603  [C0603]
C18  10uF 10V  C_0603  [C0603]
C79  22uF 6.3V  C_0603  [C0603]
C80  22uF 6.3V  C_0603  [C0603]
C2402  100pF 50V C0G  C_0402  [C0402]
C2403  100pF 50V C0G  C_0402  [C0402]
C2405  100nF 6.3V  C_0402  [C0402]
C2407  100nF 6.3V  C_0402  [C0402]
C2410  10uF 6.3V  C_0603  [C0603]
C2411  10uF 6.3V  C_0603  [C0603]
C2412  10uF 6.3V  C_0603  [C0603]
C2413  10uF 6.3V  C_0603  [C0603]
L11  1.0uH 3.2A  IND_2520  [IND_2520]
L12  1.0uH 3.2A  IND_2520  [IND_2520]
PWR176  VCC5V0_SYS_S5  (no package)
PWR179  VCC_2V0_PLDO_S3  (no package)
PWR181  VCC_2V0_PLDO_S3  (no package)
PWR183  VCC_2V0_PLDO_S3  (no package)
PWR185  VCC5V0_SYS_S5  (no package)
PWR188  VCC_1V1_NLDO_S3  (no package)
PWR190  VCC_1V1_NLDO_S3  (no package)
PWR192  VCC_1V1_NLDO_S3  (no package)
PWR194  VCC_1V8_S3  (no package)
PWR197  VCC_1V8_S0  (no package)
PWR199  VCC_3V3_S3  (no package)
PWR202  VCC_3V3_S0  (no package)
R25  249k 1%  R_0402  [R0402]
R26  100k 1%  R_0402  [R0402]
R27  100k 1%  R_0402  [R0402]
R28  120k 1%  R_0402  [R0402]
R29  3.3k 1%  R_0402  [R0402]
R2405  100k 1%  R_0402  [R0402]
R2406  10k 1%  R_0402  [R0402]
R2411  10k 1%  R_0402  [R0402]
R2412  10k 1%  R_0402  [R0402]
R2413  100k 1%  R_0402  [R0402]
R2414  100k 1%  R_0402  [R0402]
U6  TMI3112H  [SOT-23-5]
U7  TMI3112H  [SOT-23-5]
U8  SY6280AAC  [SOT95P285X130-5N]
U9  CW3301  [WLCSP-4]

### Nets
GND: C17.2 C18.2 C79.2 C80.2 C2405.2 C2407.2 C2410.2 C2411.2 C2412.2 C2413.2 R26.2 R28.2 R29.2 R2405.2 R2406.2 R2413.2 R2414.2 U6.2(GND) U7.2(GND) U8.2(GND) U9.B1(GND) ; also sheet 1,2,4,5
PMIC_EXT_EN_OUT: R2405.1 R2406.1 U6.1(EN) U7.1(EN) ; also sheet 2
U6_FB: C2403.2 R25.2 R26.1 U6.5(FB)
U6_LX: L11.1 U6.3(LX)
U7_FB: C2402.2 R27.2 R28.1 U7.5(FB)
U7_LX: L12.1 U7.3(LX)
U8_EN: R2412.2 R2414.1 U8.4(EN)
U8_ISET: R29.1 U8.3(ISET)
U9_ON: R2411.2 R2413.1 U9.B2(ON)
VCC5V0_SYS_S5: C17.1 C18.1 PWR176.VCC5V0_SYS_S5 PWR185.VCC5V0_SYS_S5 U6.4(IN) U7.4(IN) ; also sheet 1,2
VCC_1V1_NLDO_S3: C80.1 C2402.1 C2407.1 L12.2 PWR188.VCC_1V1_NLDO_S3 PWR190.VCC_1V1_NLDO_S3 PWR192.VCC_1V1_NLDO_S3 R27.1 ; also sheet 2
VCC_1V8_S0: C2411.1 PWR197.VCC_1V8_S0 U9.A1(OUT) ; also sheet 4,5
VCC_1V8_S3: C2410.1 PWR194.VCC_1V8_S3 U9.A2(IN) ; also sheet 2,4,5
VCC_2V0_PLDO_S3: C79.1 C2403.1 C2405.1 L11.2 PWR179.VCC_2V0_PLDO_S3 PWR181.VCC_2V0_PLDO_S3 PWR183.VCC_2V0_PLDO_S3 R25.1 ; also sheet 2
VCC_3V3_S0: C2413.1 PWR202.VCC_3V3_S0 U8.1(OUT) ; also sheet 4
VCC_3V3_S3: C2412.1 PWR199.VCC_3V3_S3 U8.5(IN) ; also sheet 2,4,5
VCCA_1V8_S0: R2411.1 R2412.1 ; also sheet 2,4,5

### Notes on the sheet
- PROJECT FRIDAY — S3: DISCRETE POWER (U6/U7 TMI3112H, U8 SY6280AAC, U9 CW3301) — EVB SHEET 24 (P.22) | REV SCH-1 | PRINCIPLE: COPY RK3576 EVB1 V1.2
- CITATIONS: EVB Sheet 24 p.22 (U2400-U2403); TMI3112H DS (Vref=0.6V); SY6280AAC DS (Iset=3.3k -> 2A).

## Sheet 4 of 5: S4: RK3576 Power & GND + Unused Rails
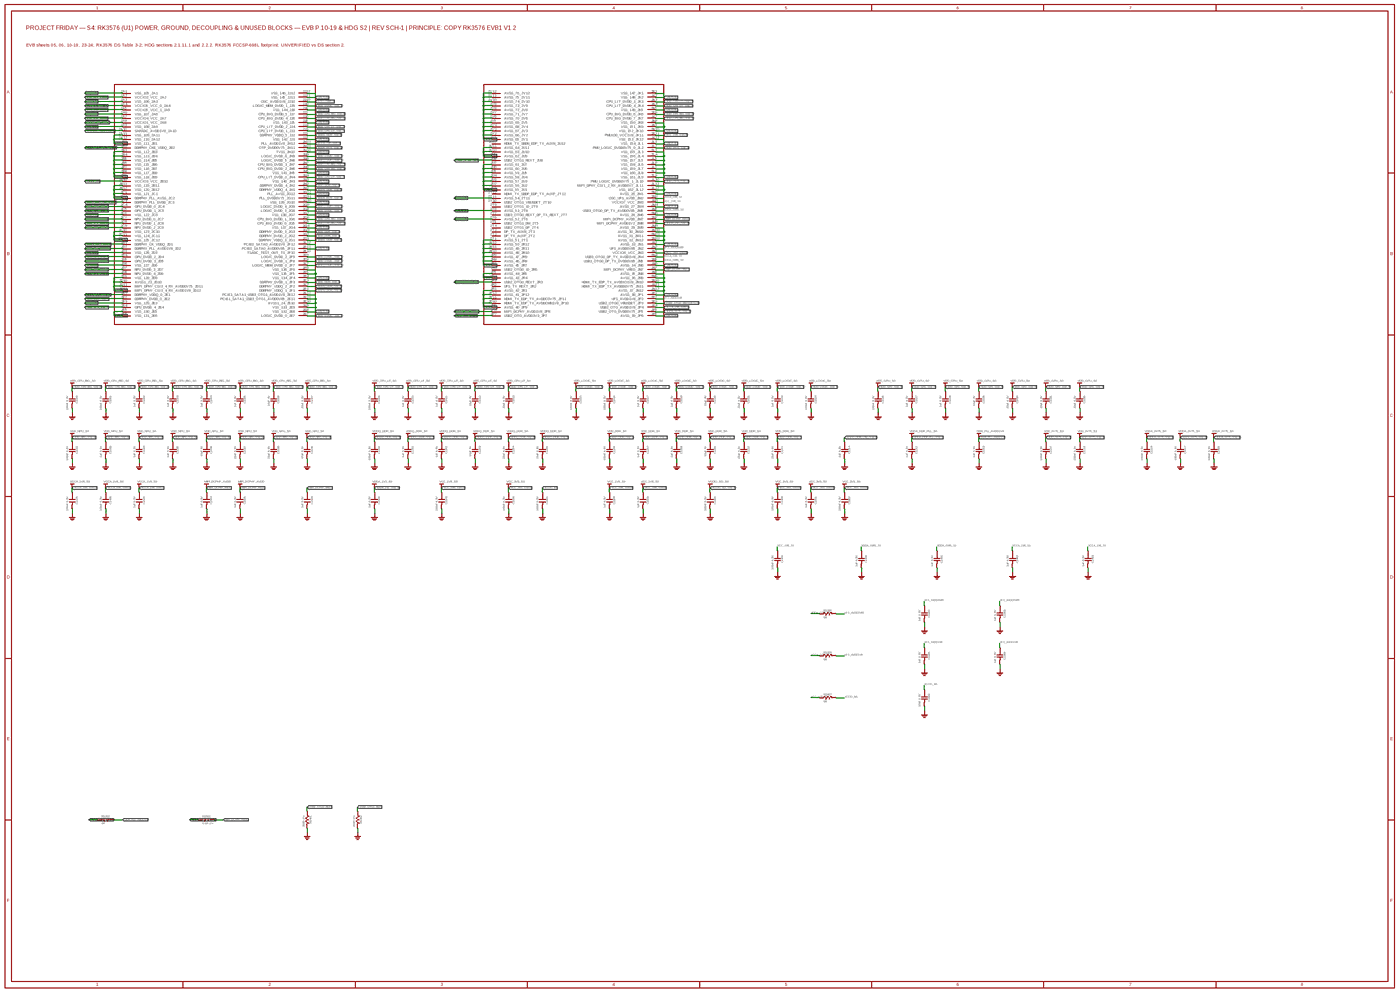
[diagram p6: schematic, sheet 4, overview]
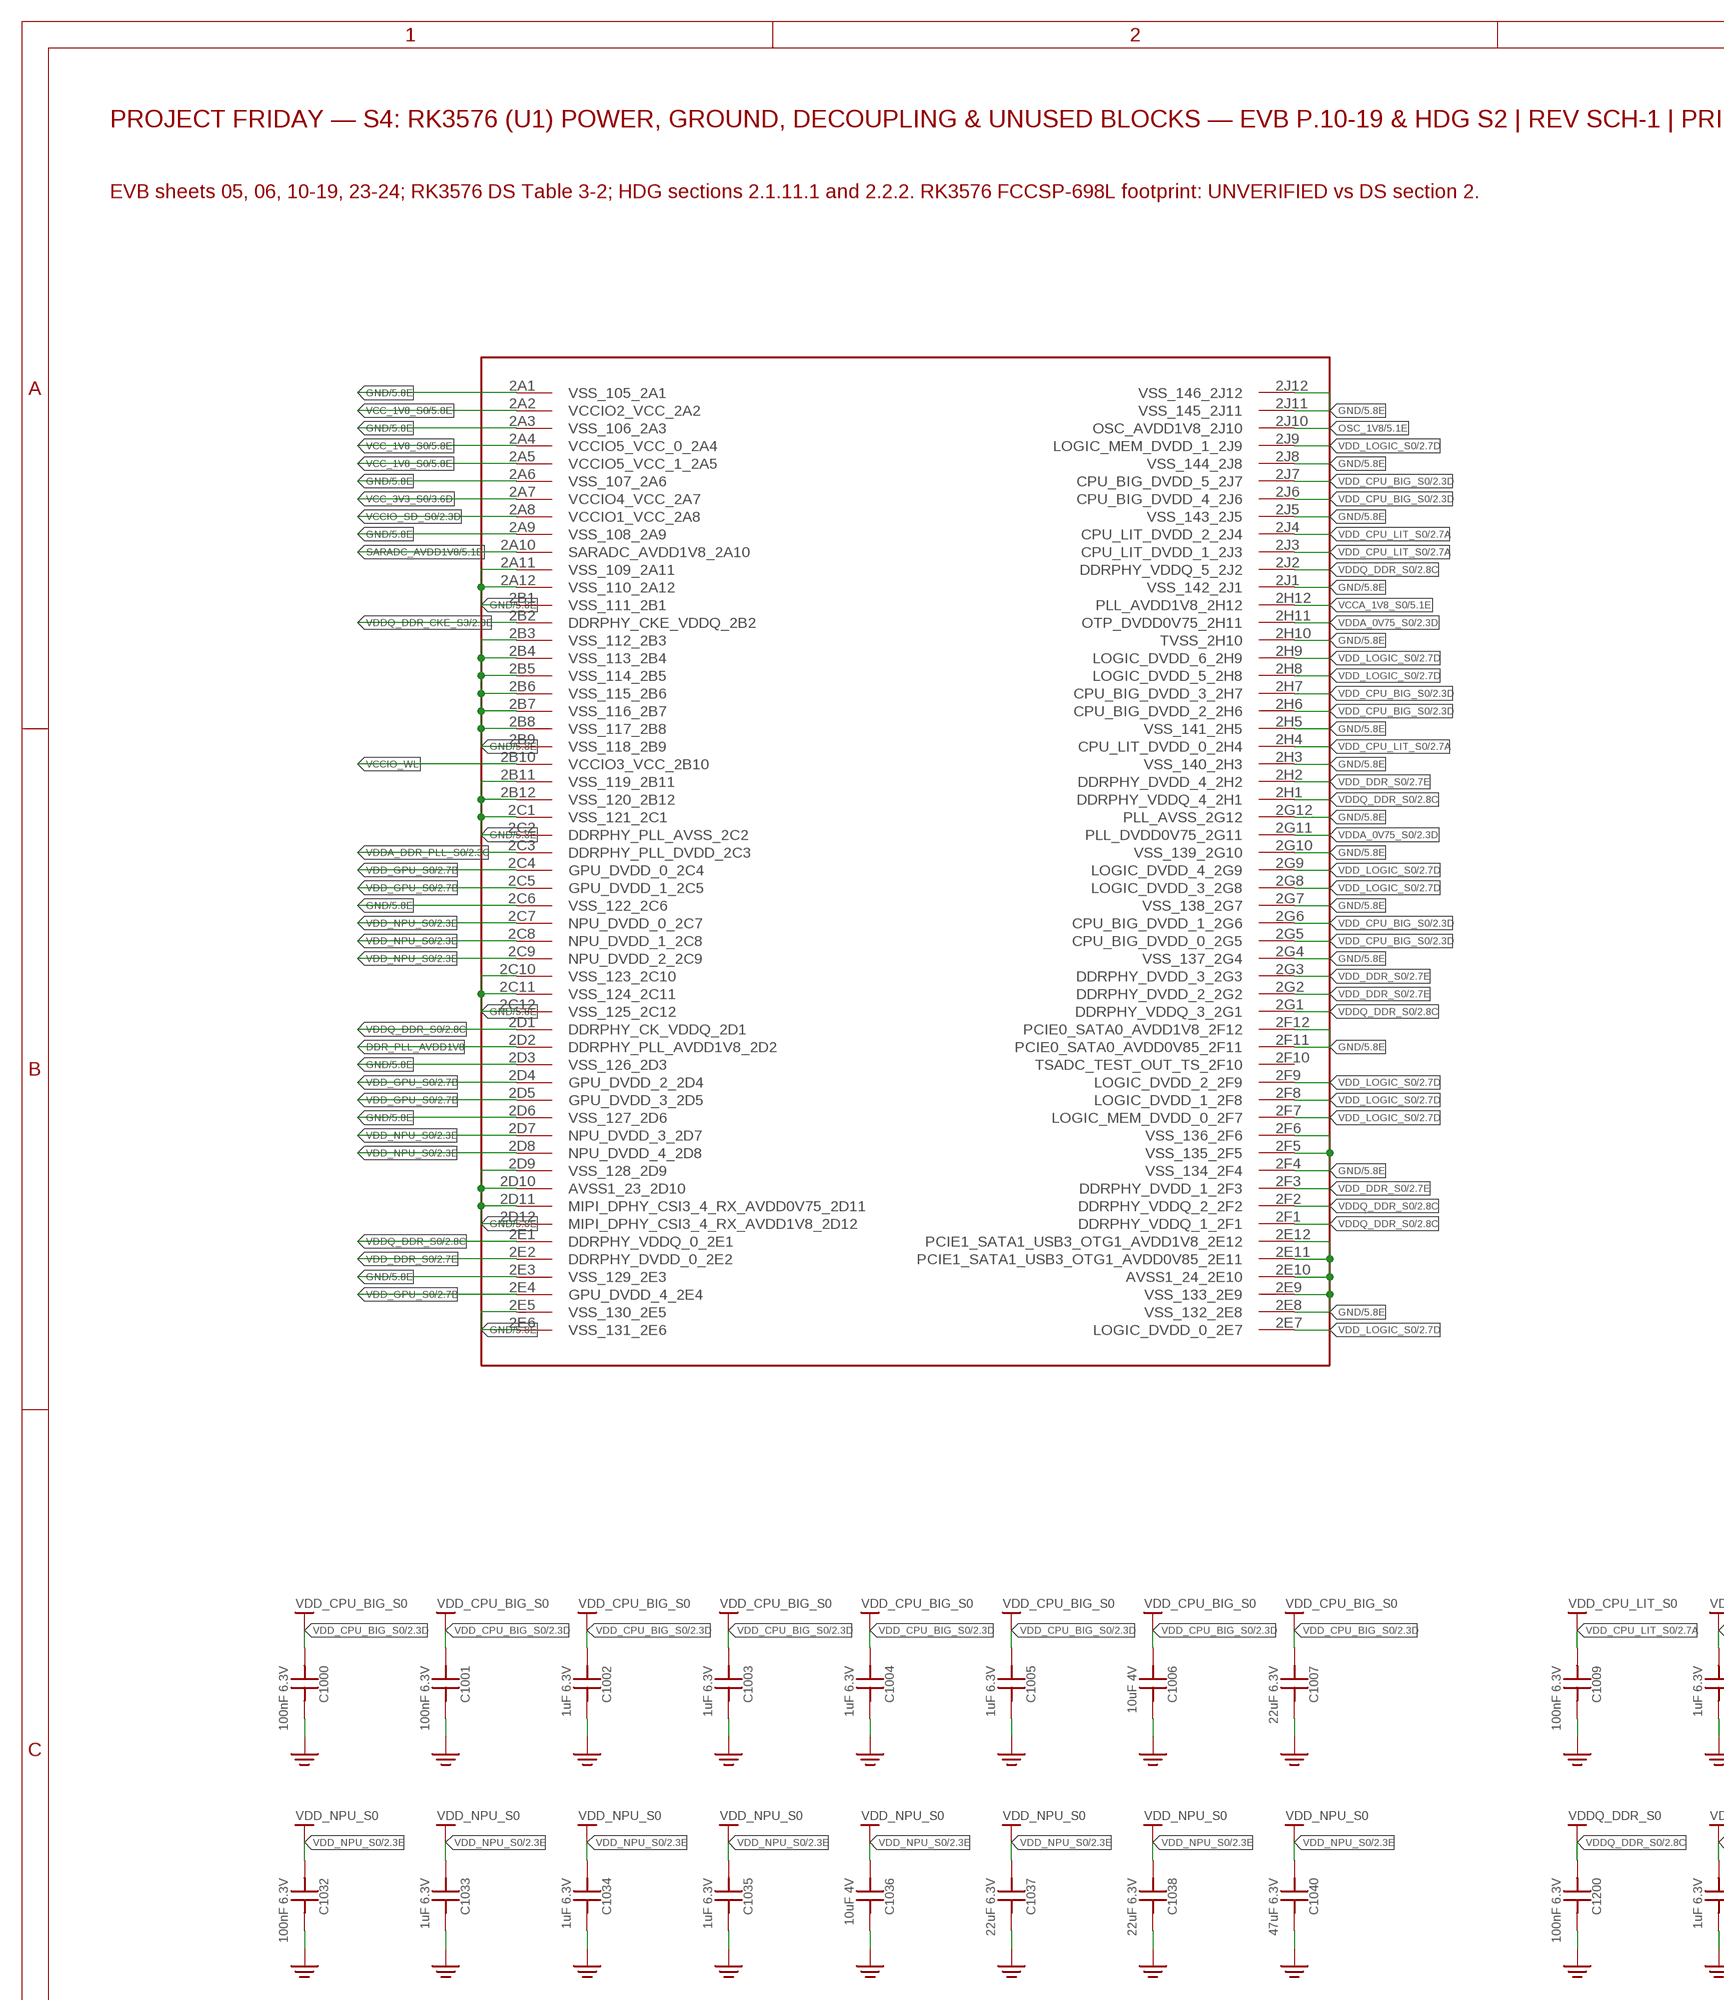
[diagram p7: schematic, sheet 4, part 1 of 6]
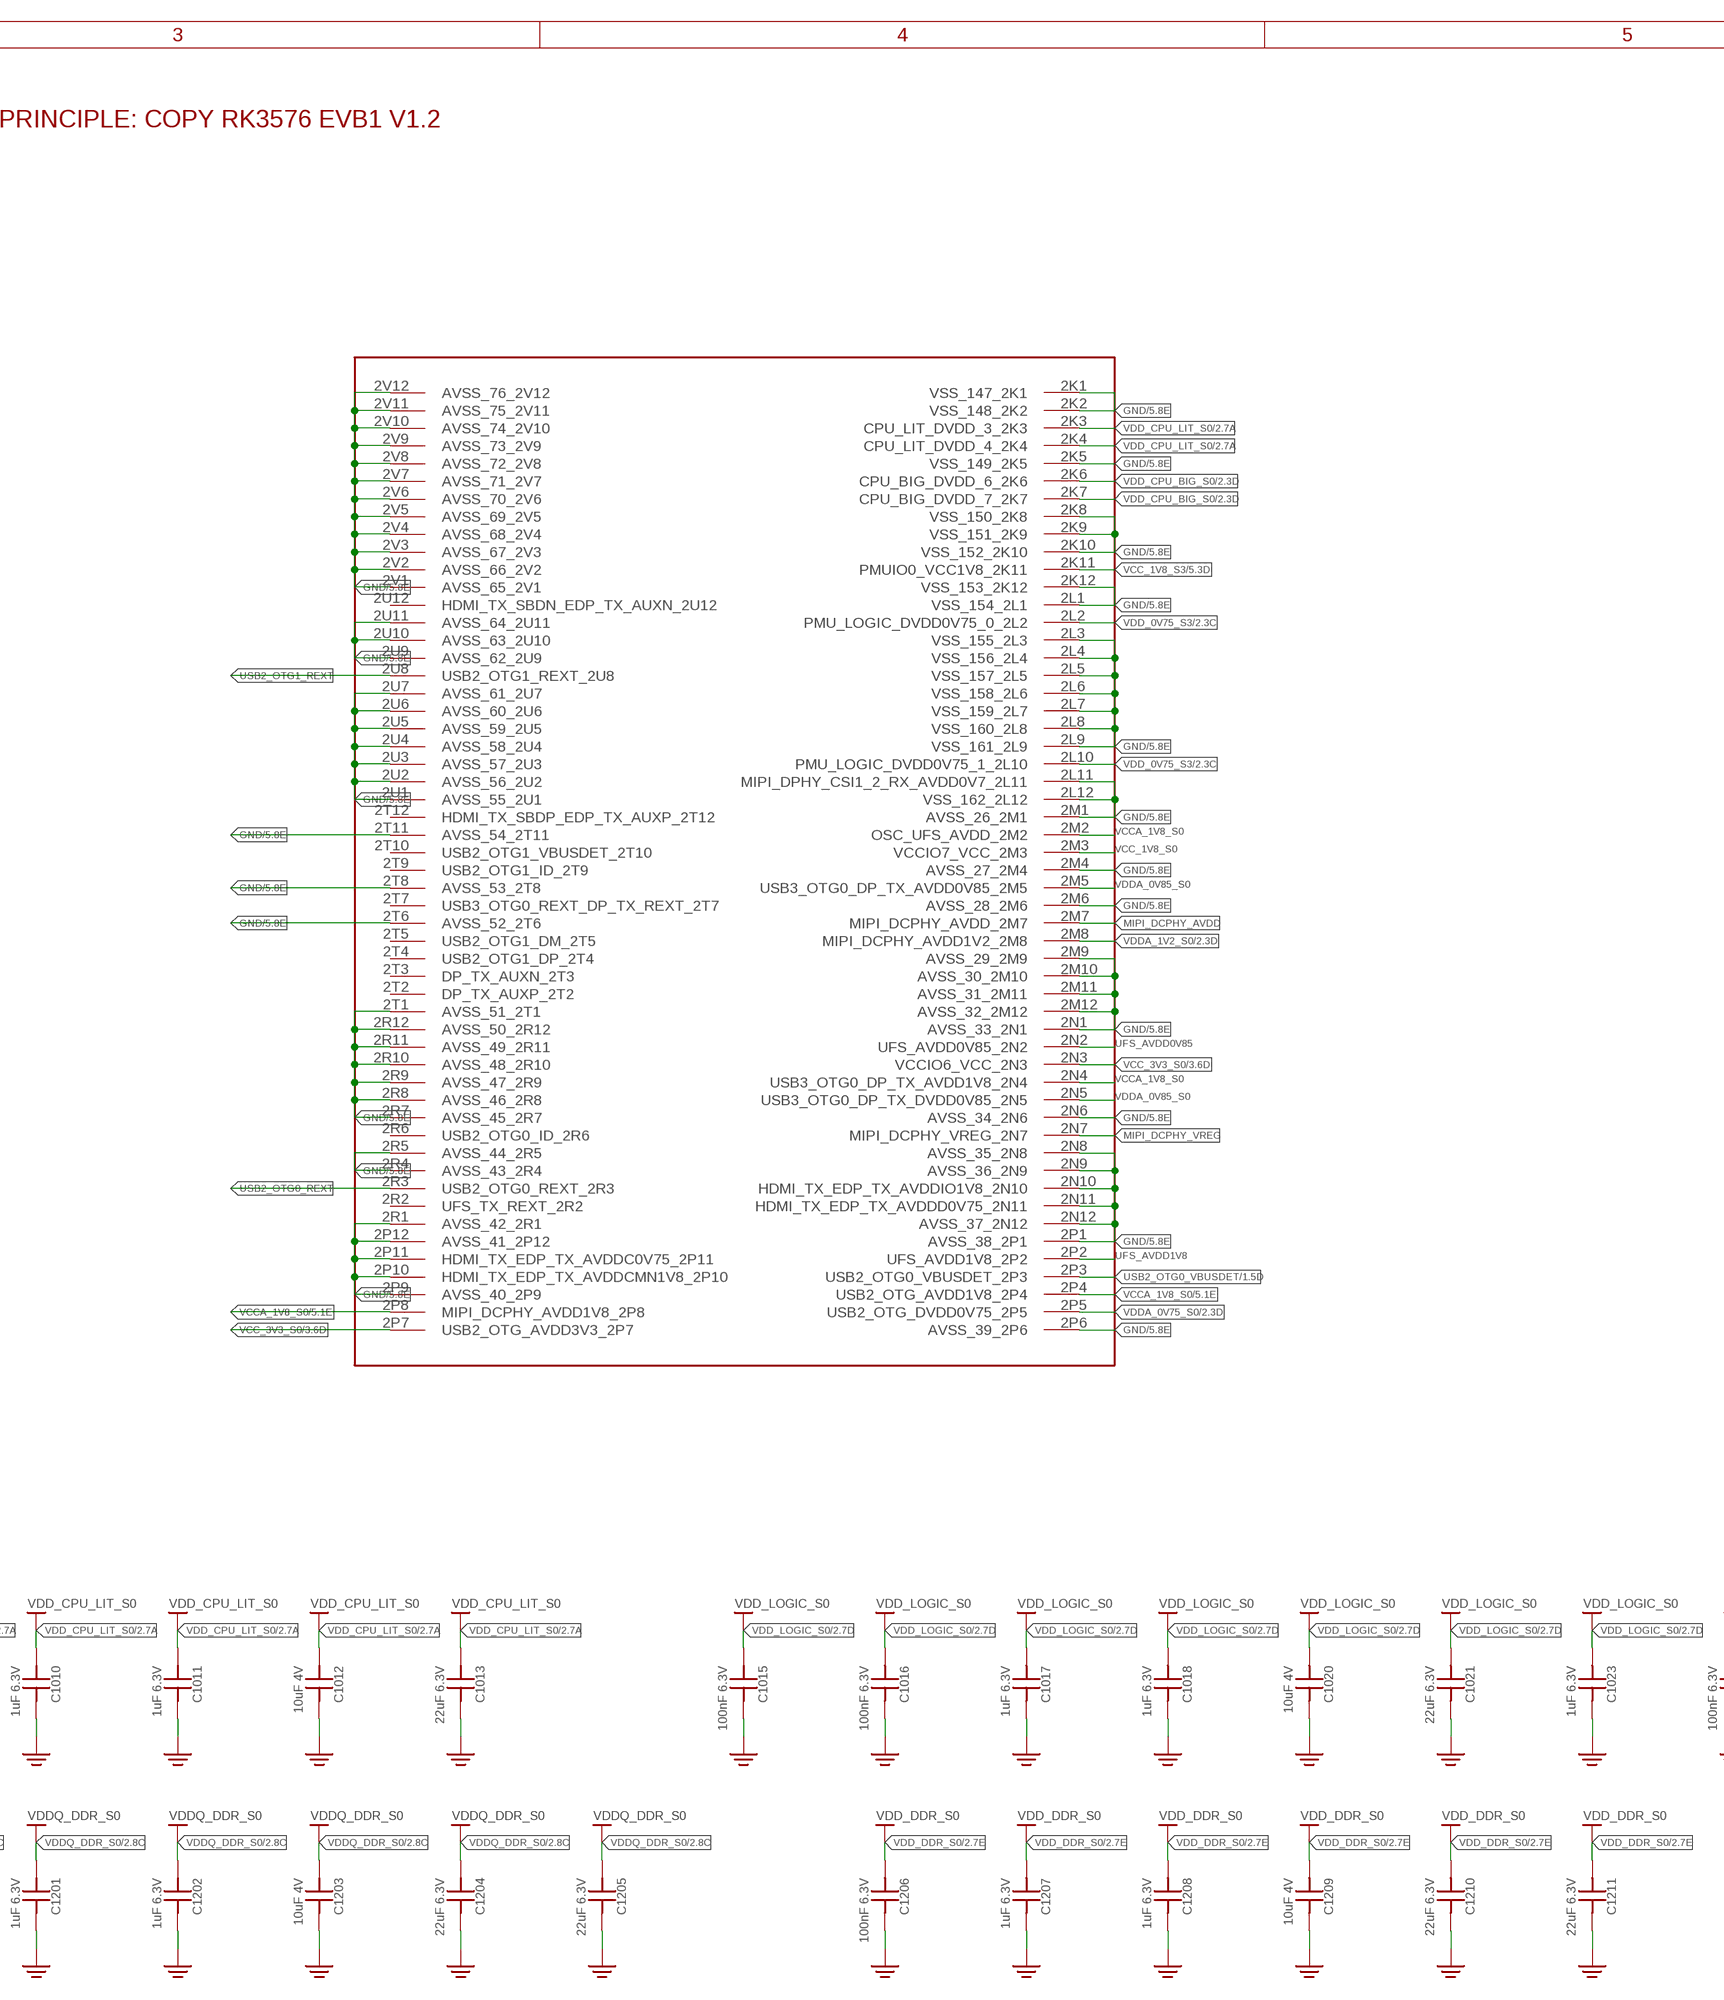
[diagram p8: schematic, sheet 4, part 2 of 6]
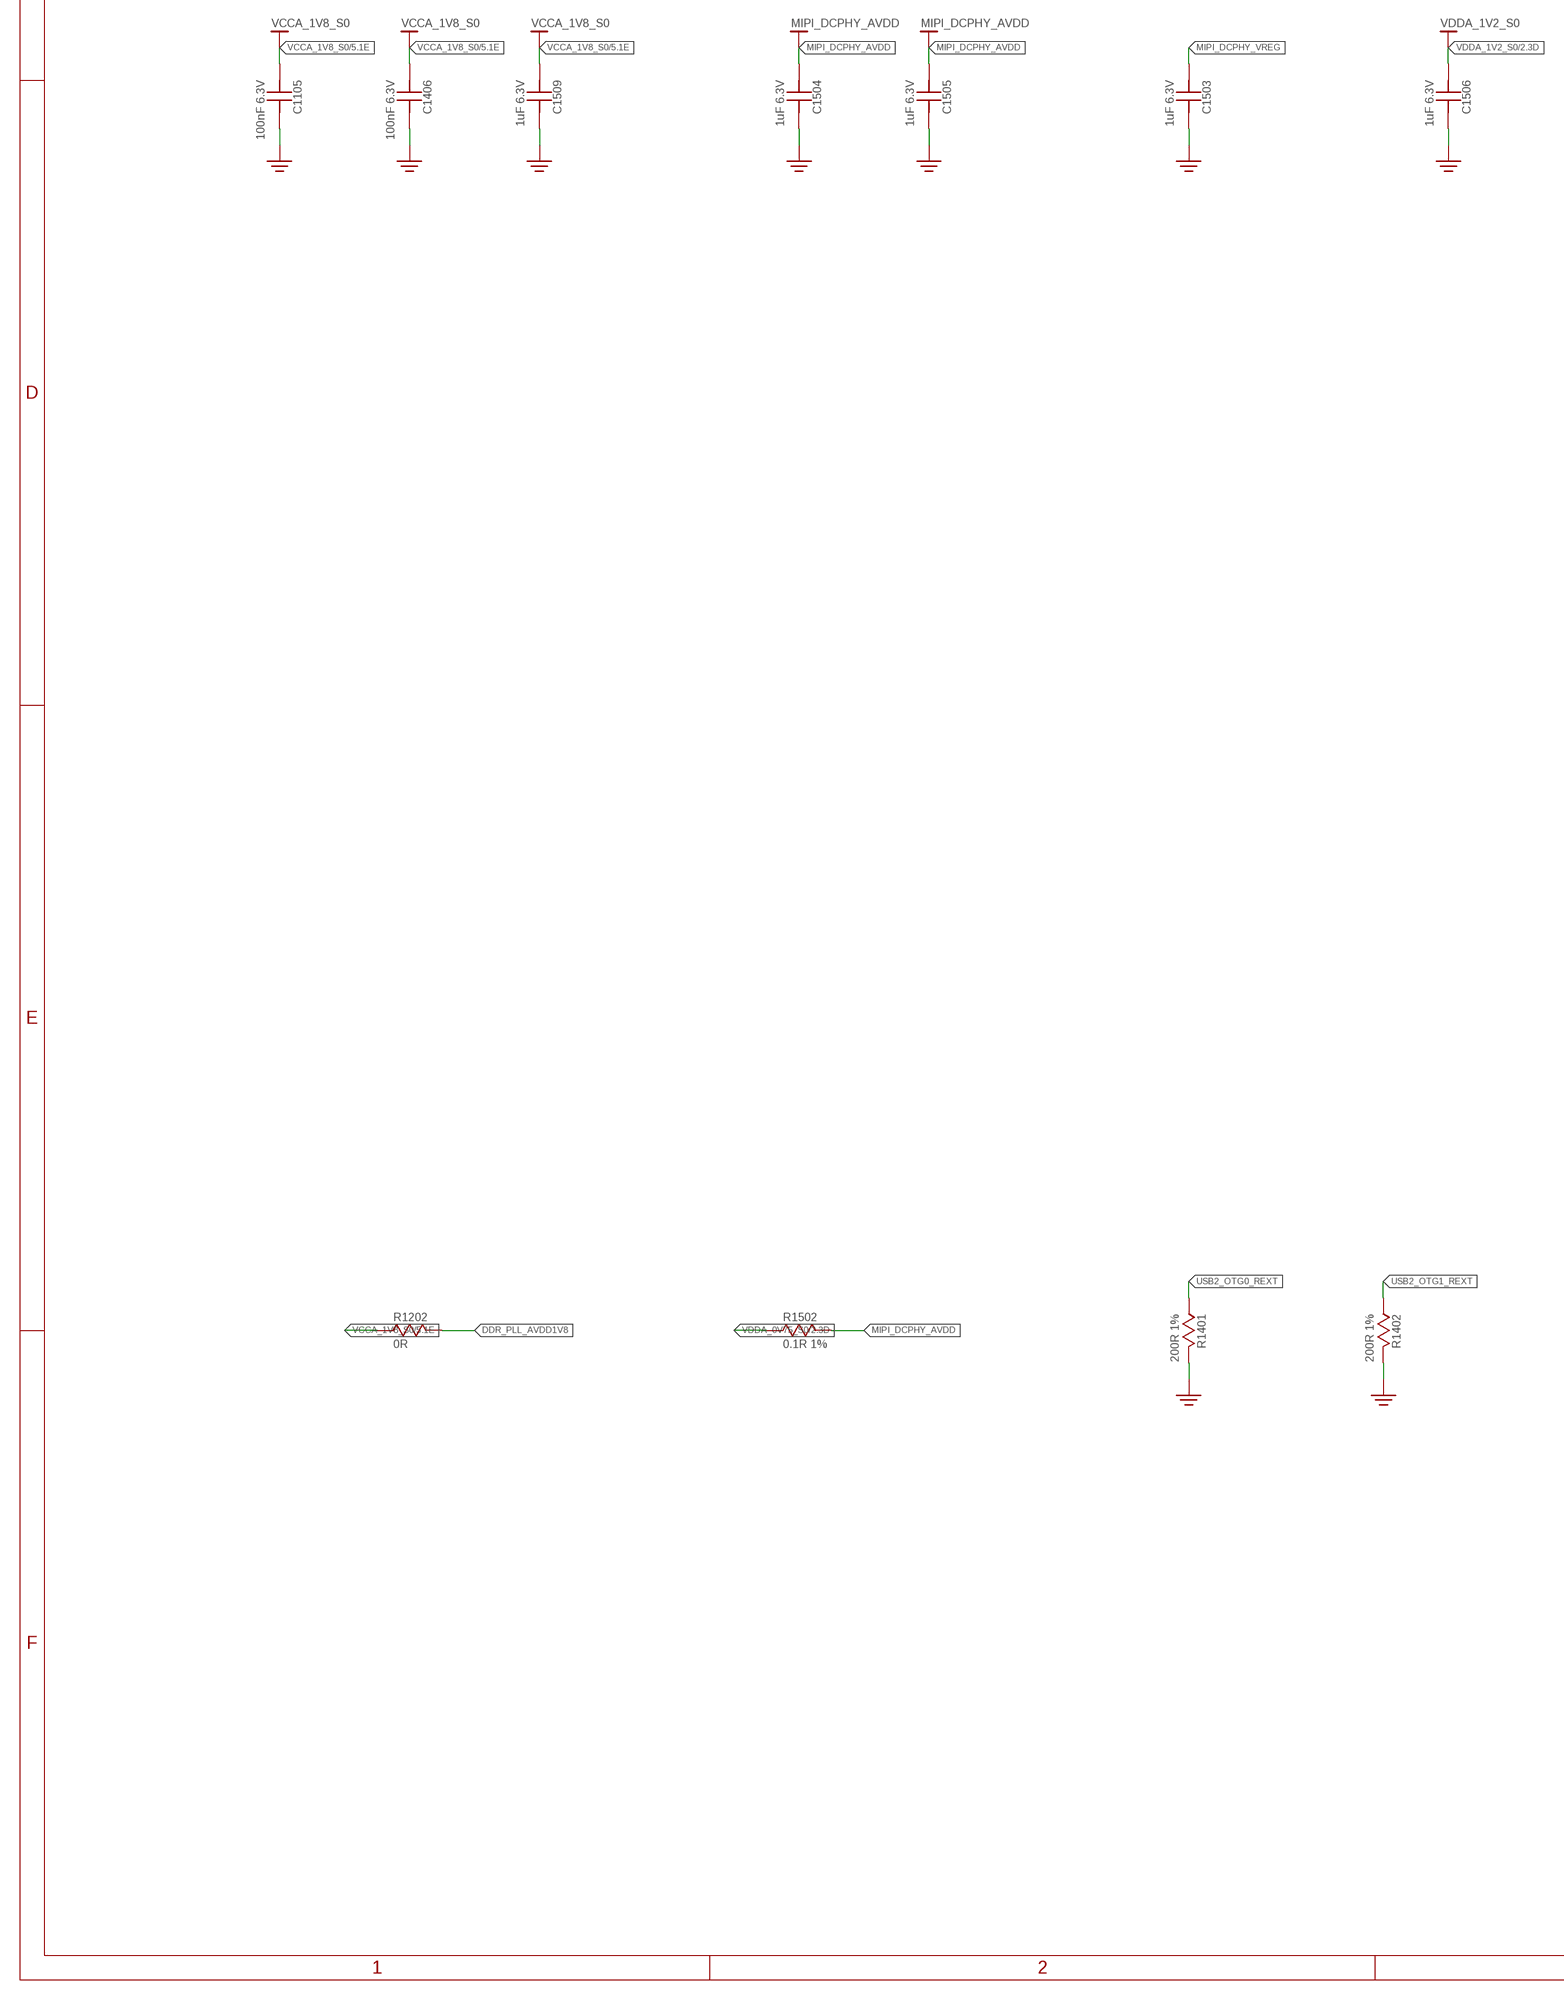
[diagram p9: schematic, sheet 4, part 3 of 6]
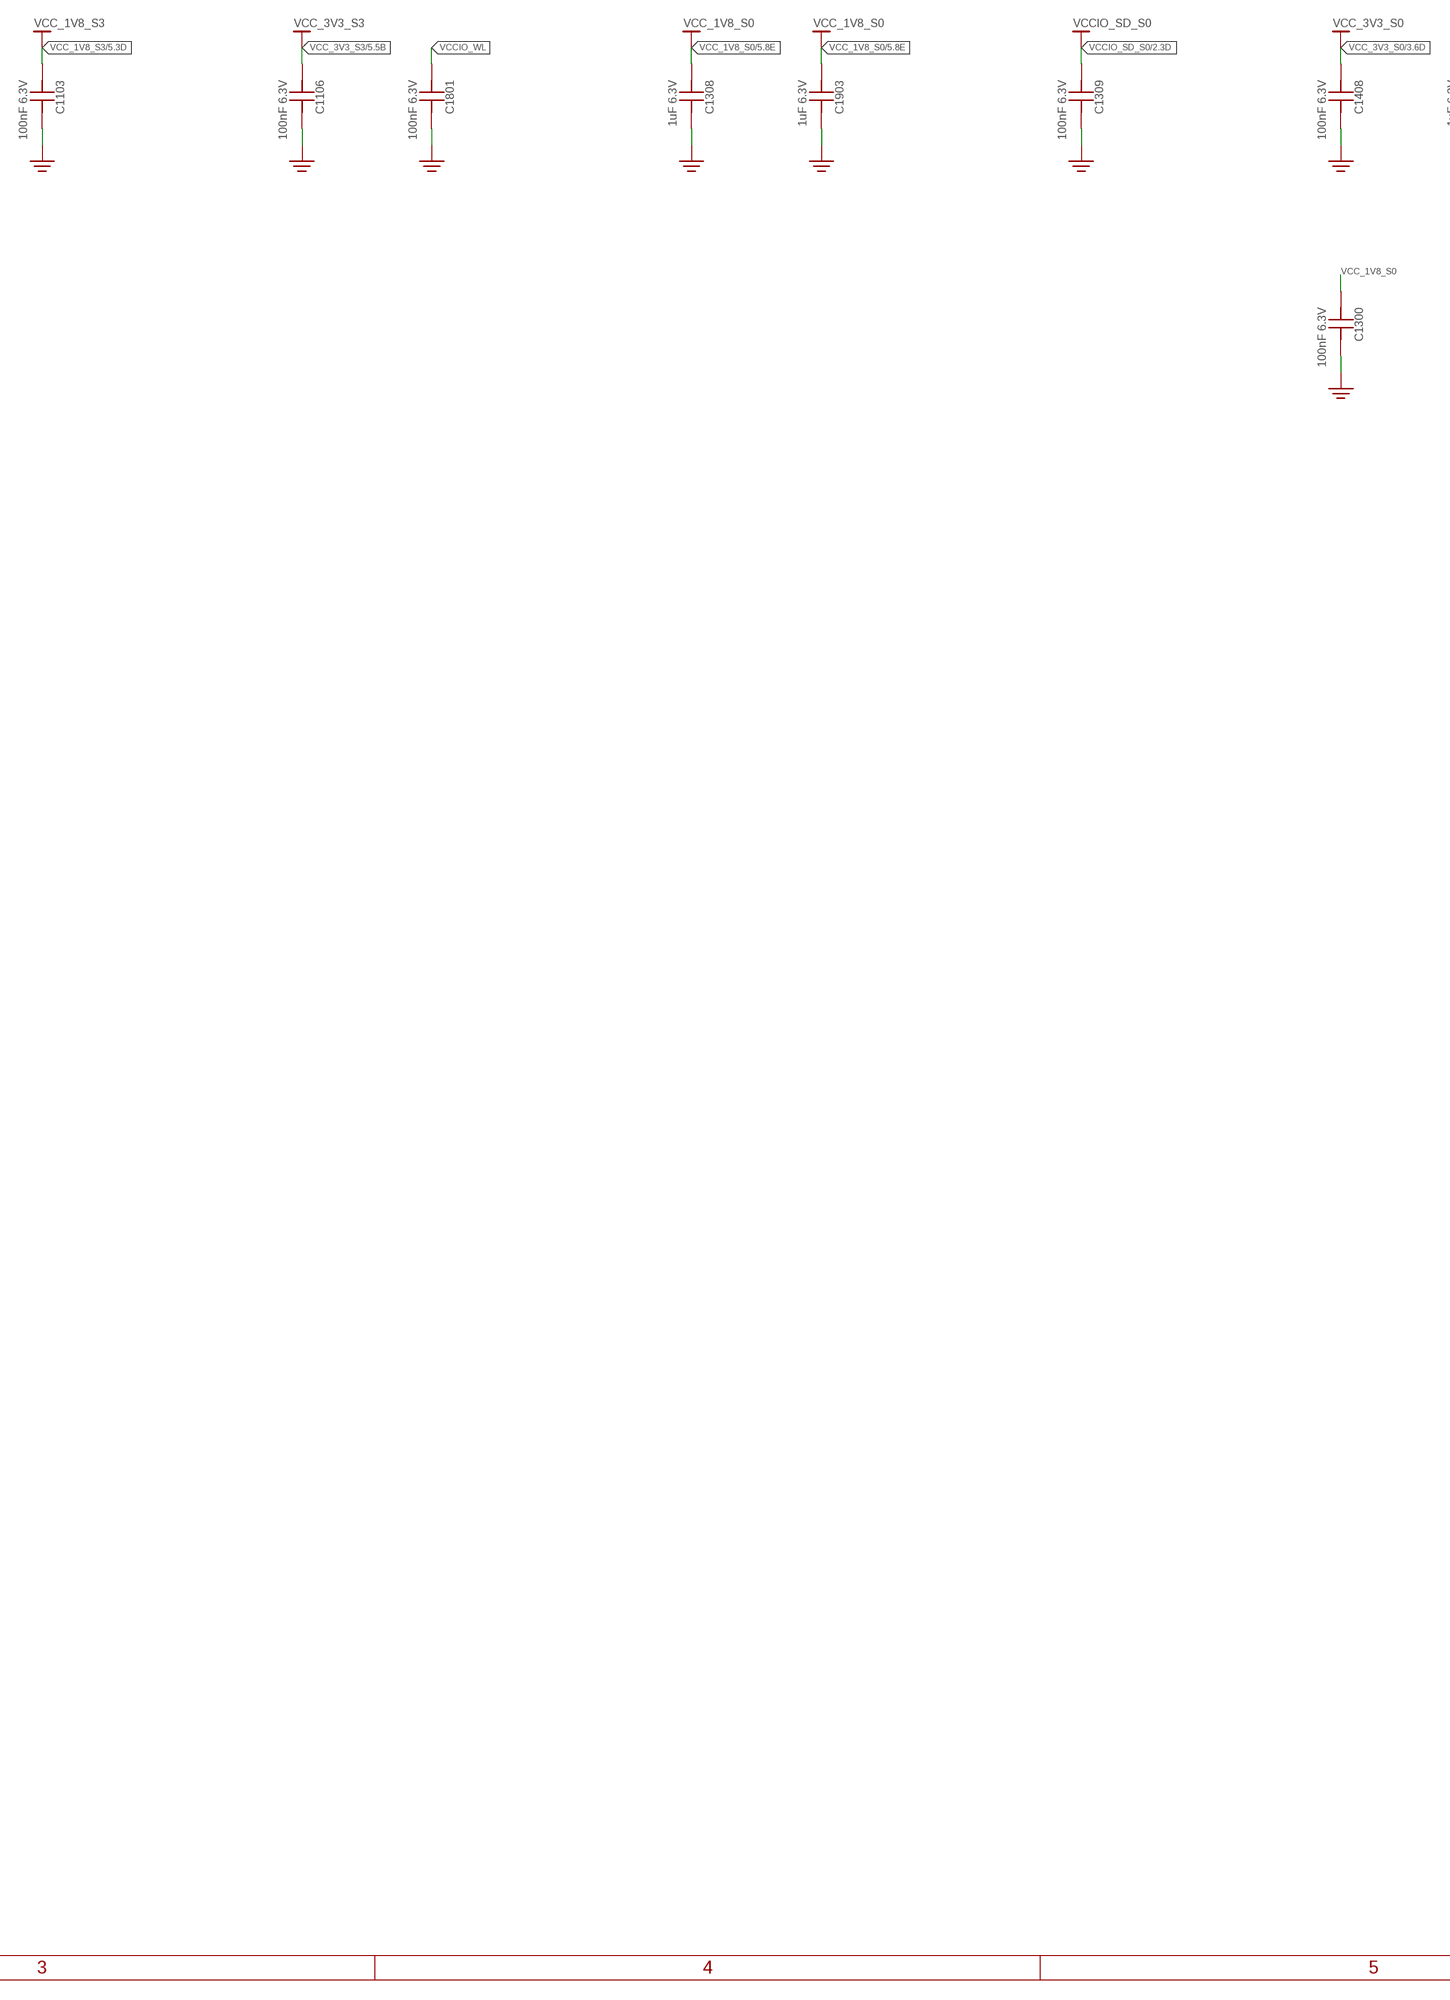
[diagram p10: schematic, sheet 4, part 4 of 6]
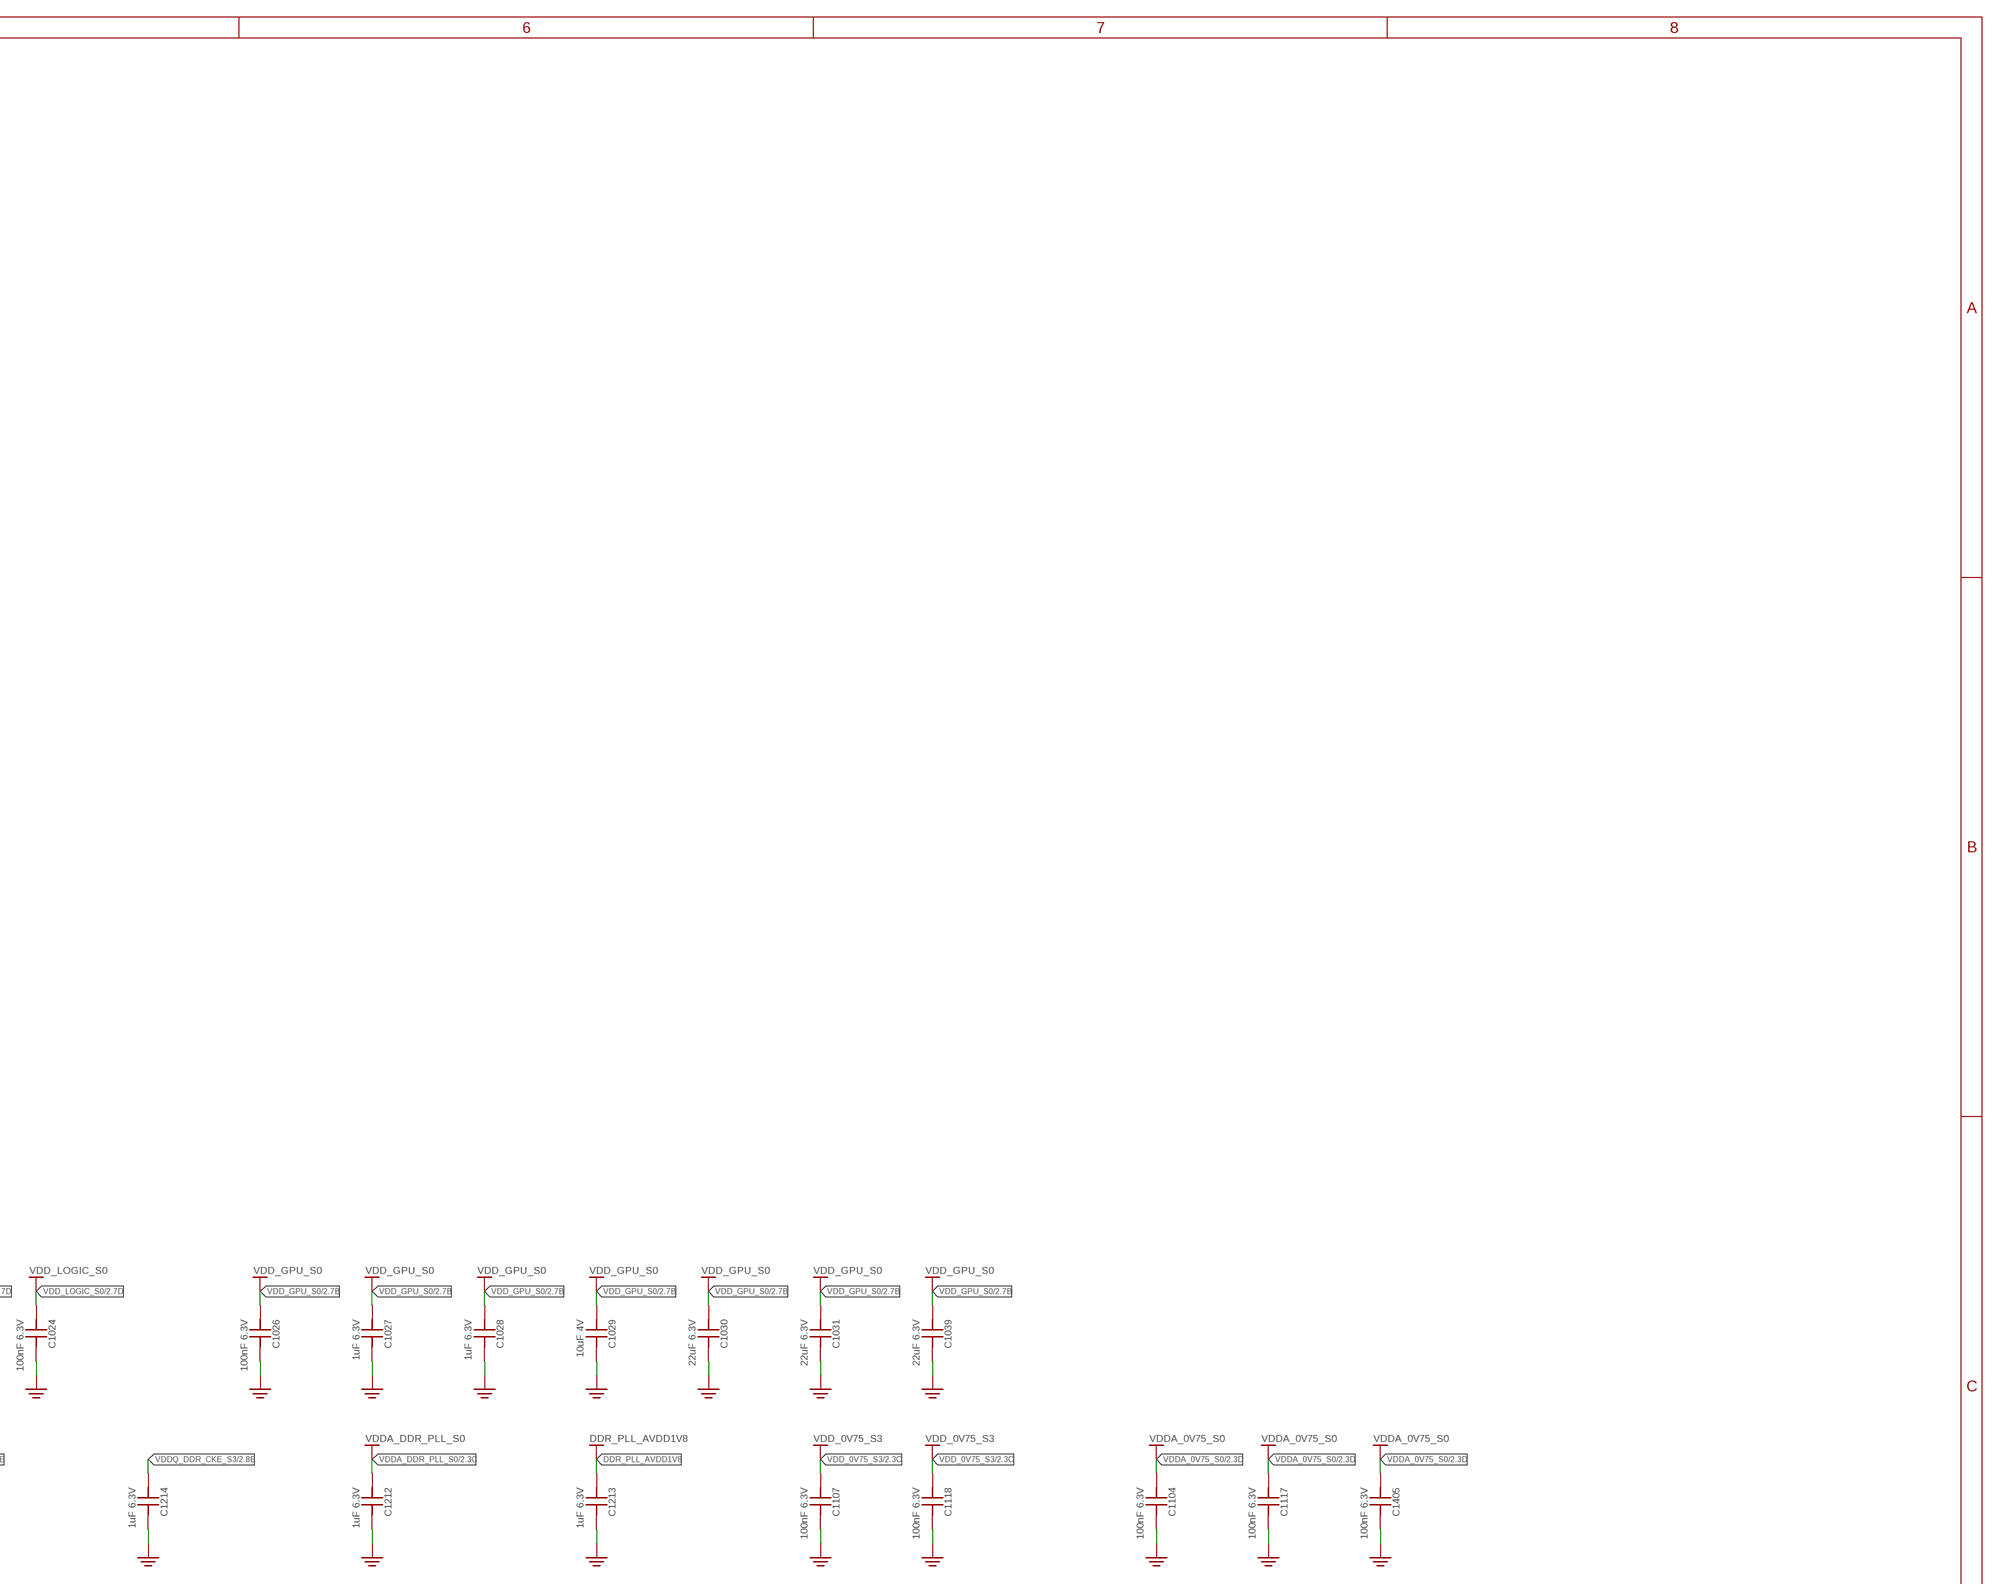
[diagram p11: schematic, sheet 4, part 5 of 6]
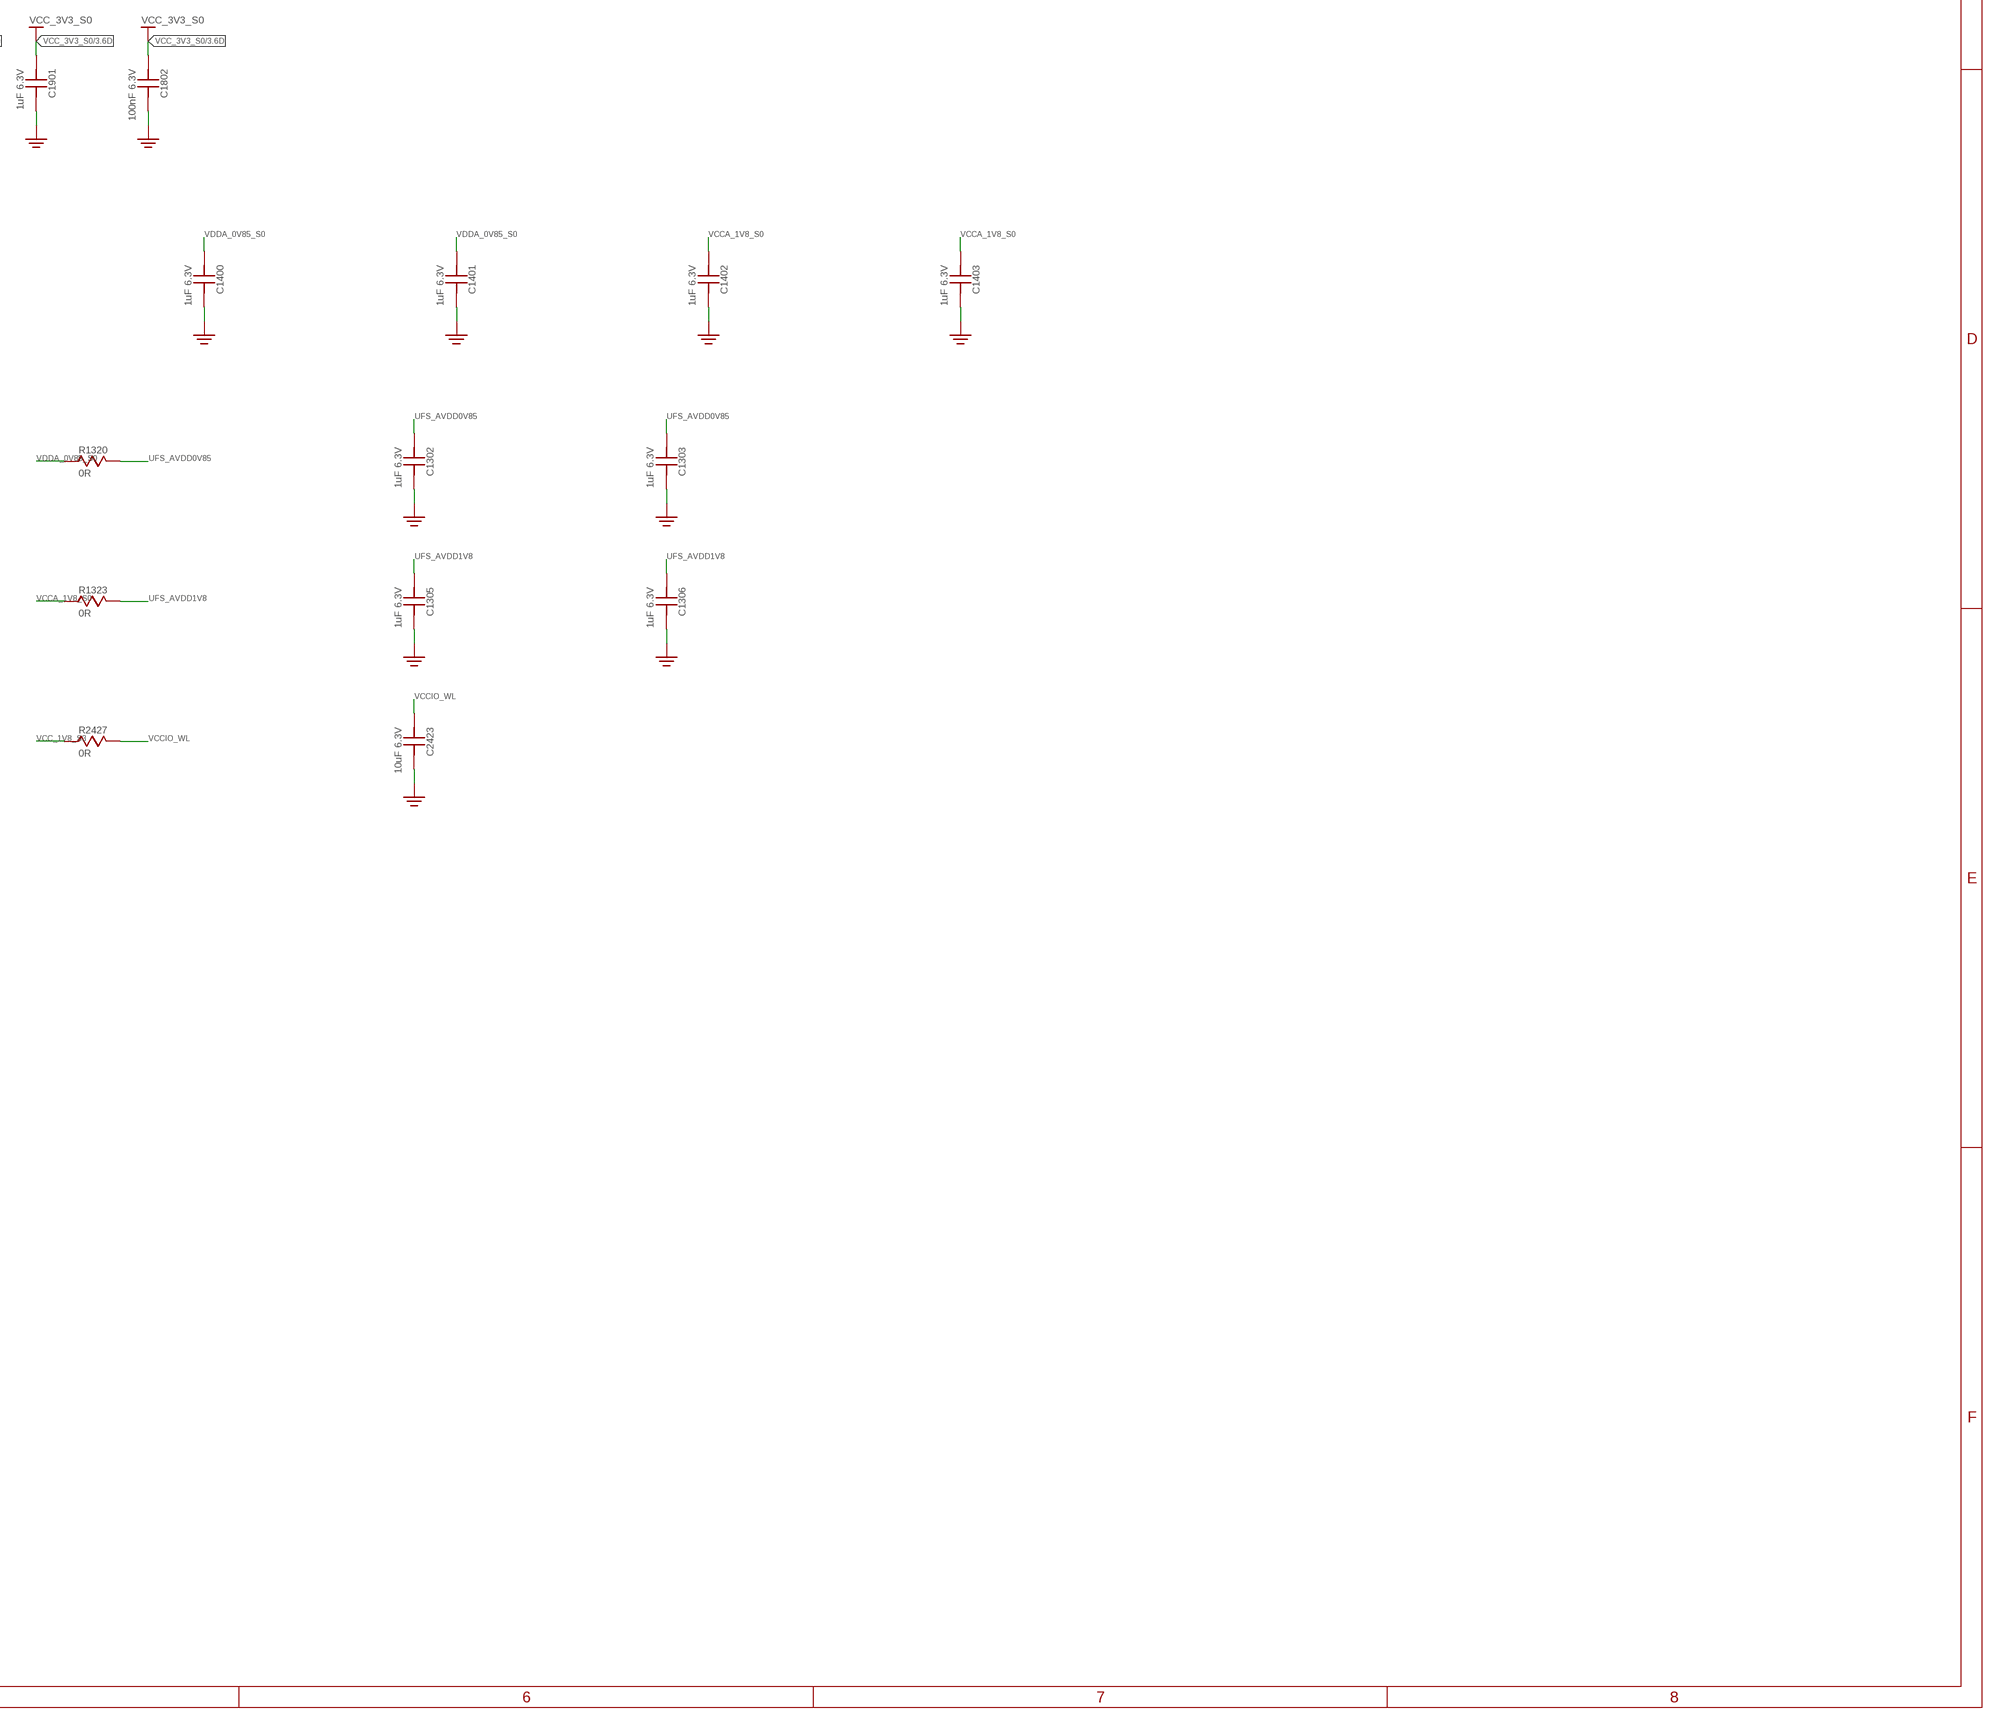
[diagram p12: schematic, sheet 4, part 6 of 6]

### Parts
C1000  100nF 6.3V  C_0201  [C0201]
C1001  100nF 6.3V  C_0201  [C0201]
C1002  1uF 6.3V  C_0201  [C0201]
C1003  1uF 6.3V  C_0201  [C0201]
C1004  1uF 6.3V  C_0201  [C0201]
C1005  1uF 6.3V  C_0201  [C0201]
C1006  10uF 4V  C_0402_BGA  [C0402_BGA]
C1007  22uF 6.3V  C_0603  [C0603]
C1009  100nF 6.3V  C_0201  [C0201]
C1010  1uF 6.3V  C_0201  [C0201]
C1011  1uF 6.3V  C_0201  [C0201]
C1012  10uF 4V  C_0402_BGA  [C0402_BGA]
C1013  22uF 6.3V  C_0603  [C0603]
C1015  100nF 6.3V  C_0201  [C0201]
C1016  100nF 6.3V  C_0201  [C0201]
C1017  1uF 6.3V  C_0201  [C0201]
C1018  1uF 6.3V  C_0201  [C0201]
C1020  10uF 4V  C_0402_BGA  [C0402_BGA]
C1021  22uF 6.3V  C_0603  [C0603]
C1023  1uF 6.3V  C_0201  [C0201]
C1024  100nF 6.3V  C_0201  [C0201]
C1026  100nF 6.3V  C_0201  [C0201]
C1027  1uF 6.3V  C_0201  [C0201]
C1028  1uF 6.3V  C_0201  [C0201]
C1029  10uF 4V  C_0402_BGA  [C0402_BGA]
C1030  22uF 6.3V  C_0603  [C0603]
C1031  22uF 6.3V  C_0603  [C0603]
C1032  100nF 6.3V  C_0201  [C0201]
C1033  1uF 6.3V  C_0201  [C0201]
C1034  1uF 6.3V  C_0201  [C0201]
C1035  1uF 6.3V  C_0201  [C0201]
C1036  10uF 4V  C_0402_BGA  [C0402_BGA]
C1037  22uF 6.3V  C_0603  [C0603]
C1038  22uF 6.3V  C_0603  [C0603]
C1039  22uF 6.3V  C_0603  [C0603]
C1040  47uF 6.3V  C_0805  [C0805]
C1103  100nF 6.3V  C_0201  [C0201]
C1104  100nF 6.3V  C_0201  [C0201]
C1105  100nF 6.3V  C_0201  [C0201]
C1106  100nF 6.3V  C_0201  [C0201]
C1107  100nF 6.3V  C_0201  [C0201]
C1117  100nF 6.3V  C_0201  [C0201]
C1118  100nF 6.3V  C_0201  [C0201]
C1200  100nF 6.3V  C_0201  [C0201]
C1201  1uF 6.3V  C_0201  [C0201]
C1202  1uF 6.3V  C_0201  [C0201]
C1203  10uF 4V  C_0402_BGA  [C0402_BGA]
C1204  22uF 6.3V  C_0603  [C0603]
C1205  22uF 6.3V  C_0603  [C0603]
C1206  100nF 6.3V  C_0201  [C0201]
C1207  1uF 6.3V  C_0201  [C0201]
C1208  1uF 6.3V  C_0201  [C0201]
C1209  10uF 4V  C_0402_BGA  [C0402_BGA]
C1210  22uF 6.3V  C_0603  [C0603]
C1211  22uF 6.3V  C_0603  [C0603]
C1212  1uF 6.3V  C_0201  [C0201]
C1213  1uF 6.3V  C_0201  [C0201]
C1214  1uF 6.3V  C_0201  [C0201]
C1300  100nF 6.3V  C_0201  [C0201]
C1302  1uF 6.3V  C_0201  [C0201]
C1303  1uF 6.3V  C_0402  [C0402]
C1305  1uF 6.3V  C_0201  [C0201]
C1306  1uF 6.3V  C_0402  [C0402]
C1308  1uF 6.3V  C_0201  [C0201]
C1309  100nF 6.3V  C_0201  [C0201]
C1400  1uF 6.3V  C_0201  [C0201]
C1401  1uF 6.3V  C_0201  [C0201]  (not fitted in variant default)
C1402  1uF 6.3V  C_0201  [C0201]
C1403  1uF 6.3V  C_0201  [C0201]  (not fitted in variant default)
C1405  100nF 6.3V  C_0201  [C0201]
C1406  100nF 6.3V  C_0201  [C0201]
C1408  100nF 6.3V  C_0201  [C0201]
C1503  1uF 6.3V  C_0201  [C0201]
C1504  1uF 6.3V  C_0201  [C0201]
C1505  1uF 6.3V  C_0201  [C0201]
C1506  1uF 6.3V  C_0201  [C0201]
C1509  1uF 6.3V  C_0201  [C0201]
C1801  100nF 6.3V  C_0201  [C0201]
C1802  100nF 6.3V  C_0201  [C0201]
C1901  1uF 6.3V  C_0201  [C0201]
C1903  1uF 6.3V  C_0201  [C0201]
C2423  10uF 6.3V  C_0603  [C0603]
PWR205  VDD_CPU_BIG_S0  (no package)
PWR207  VDD_CPU_BIG_S0  (no package)
PWR209  VDD_CPU_BIG_S0  (no package)
PWR211  VDD_CPU_BIG_S0  (no package)
PWR213  VDD_CPU_BIG_S0  (no package)
PWR215  VDD_CPU_BIG_S0  (no package)
PWR217  VDD_CPU_BIG_S0  (no package)
PWR219  VDD_CPU_BIG_S0  (no package)
PWR221  VDD_CPU_LIT_S0  (no package)
PWR223  VDD_CPU_LIT_S0  (no package)
PWR225  VDD_CPU_LIT_S0  (no package)
PWR227  VDD_CPU_LIT_S0  (no package)
PWR229  VDD_CPU_LIT_S0  (no package)
PWR231  VDD_LOGIC_S0  (no package)
PWR233  VDD_LOGIC_S0  (no package)
PWR235  VDD_LOGIC_S0  (no package)
PWR237  VDD_LOGIC_S0  (no package)
PWR239  VDD_LOGIC_S0  (no package)
PWR241  VDD_LOGIC_S0  (no package)
PWR243  VDD_LOGIC_S0  (no package)
PWR245  VDD_LOGIC_S0  (no package)
PWR247  VDD_GPU_S0  (no package)
PWR249  VDD_GPU_S0  (no package)
PWR251  VDD_GPU_S0  (no package)
PWR253  VDD_GPU_S0  (no package)
PWR255  VDD_GPU_S0  (no package)
PWR257  VDD_GPU_S0  (no package)
PWR259  VDD_GPU_S0  (no package)
PWR261  VDD_NPU_S0  (no package)
PWR263  VDD_NPU_S0  (no package)
PWR265  VDD_NPU_S0  (no package)
PWR267  VDD_NPU_S0  (no package)
PWR269  VDD_NPU_S0  (no package)
PWR271  VDD_NPU_S0  (no package)
PWR273  VDD_NPU_S0  (no package)
PWR275  VDD_NPU_S0  (no package)
PWR277  VDDQ_DDR_S0  (no package)
PWR279  VDDQ_DDR_S0  (no package)
PWR281  VDDQ_DDR_S0  (no package)
PWR283  VDDQ_DDR_S0  (no package)
PWR285  VDDQ_DDR_S0  (no package)
PWR287  VDDQ_DDR_S0  (no package)
PWR289  VDD_DDR_S0  (no package)
PWR291  VDD_DDR_S0  (no package)
PWR293  VDD_DDR_S0  (no package)
PWR295  VDD_DDR_S0  (no package)
PWR297  VDD_DDR_S0  (no package)
PWR299  VDD_DDR_S0  (no package)
PWR303  VDDA_DDR_PLL_S0  (no package)
PWR305  DDR_PLL_AVDD1V8  (no package)
PWR307  VDD_0V75_S3  (no package)
PWR309  VDD_0V75_S3  (no package)
PWR311  VDDA_0V75_S0  (no package)
PWR313  VDDA_0V75_S0  (no package)
PWR315  VDDA_0V75_S0  (no package)
PWR317  VCCA_1V8_S0  (no package)
PWR319  VCCA_1V8_S0  (no package)
PWR321  VCCA_1V8_S0  (no package)
PWR323  MIPI_DCPHY_AVDD  (no package)
PWR325  MIPI_DCPHY_AVDD  (no package)
PWR328  VDDA_1V2_S0  (no package)
PWR330  VCC_1V8_S3  (no package)
PWR332  VCC_3V3_S3  (no package)
PWR336  VCC_1V8_S0  (no package)
PWR338  VCC_1V8_S0  (no package)
PWR340  VCCIO_SD_S0  (no package)
PWR342  VCC_3V3_S0  (no package)
PWR344  VCC_3V3_S0  (no package)
PWR346  VCC_3V3_S0  (no package)
R1202  0R  R_0402  [R0402]
R1320  0R  R_0603  [R0603]
R1323  0R  R_0603  [R0603]
R1401  200R 1%  R_0201  [R0201]
R1402  200R 1%  R_0201  [R0201]
R1502  0.1R 1%  R_0603  [R0603]
R2427  0R  R_0603  [R0603]
U1  RK3576  [FCCSP-698_L17.2-W16.1-TL_RK3576]

### Nets
DDR_PLL_AVDD1V8: C1213.1 PWR305.DDR_PLL_AVDD1V8 R1202.2 U1.2D2(U$5:DDRPHY_PLL_AVDD1V8_2D2)
GND: C1000.2 C1001.2 C1002.2 C1003.2 C1004.2 C1005.2 C1006.2 C1007.2 C1009.2 C1010.2 C1011.2 C1012.2 C1013.2 C1015.2 C1016.2 C1017.2 C1018.2 C1020.2 C1021.2 C1023.2 C1024.2 C1026.2 C1027.2 C1028.2 C1029.2 C1030.2 C1031.2 C1032.2 C1033.2 C1034.2 C1035.2 C1036.2 C1037.2 C1038.2 C1039.2 C1040.2 C1103.2 C1104.2 C1105.2 C1106.2 C1107.2 C1117.2 C1118.2 C1200.2 C1201.2 C1202.2 C1203.2 C1204.2 C1205.2 C1206.2 C1207.2 C1208.2 C1209.2 C1210.2 C1211.2 C1212.2 C1213.2 C1214.2 C1300.2 C1302.2 C1303.2 C1305.2 C1306.2 C1308.2 C1309.2 C1400.2 C1401.2 C1402.2 C1403.2 C1405.2 C1406.2 C1408.2 C1503.2 C1504.2 C1505.2 C1506.2 C1509.2 C1801.2 C1802.2 C1901.2 C1903.2 C2423.2 R1401.2 R1402.2 U1.2A1(U$5:VSS_105_2A1) U1.2A3(U$5:VSS_106_2A3) U1.2A6(U$5:VSS_107_2A6) U1.2A9(U$5:VSS_108_2A9) U1.2A11(U$5:VSS_109_2A11) U1.2A12(U$5:VSS_110_2A12) U1.2B1(U$5:VSS_111_2B1) U1.2B3(U$5:VSS_112_2B3) U1.2B4(U$5:VSS_113_2B4) U1.2B5(U$5:VSS_114_2B5) U1.2B6(U$5:VSS_115_2B6) U1.2B7(U$5:VSS_116_2B7) U1.2B8(U$5:VSS_117_2B8) U1.2B9(U$5:VSS_118_2B9) U1.2B11(U$5:VSS_119_2B11) U1.2B12(U$5:VSS_120_2B12) U1.2C1(U$5:VSS_121_2C1) U1.2C2(U$5:DDRPHY_PLL_AVSS_2C2) U1.2C6(U$5:VSS_122_2C6) U1.2C10(U$5:VSS_123_2C10) U1.2C11(U$5:VSS_124_2C11) U1.2C12(U$5:VSS_125_2C12) U1.2D3(U$5:VSS_126_2D3) U1.2D6(U$5:VSS_127_2D6) U1.2D9(U$5:VSS_128_2D9) U1.2D10(U$5:AVSS1_23_2D10) U1.2D11(U$5:MIPI_DPHY_CSI3_4_RX_AVDD0V75_2D11) U1.2D12(U$5:MIPI_DPHY_CSI3_4_RX_AVDD1V8_2D12) U1.2E3(U$5:VSS_129_2E3) U1.2E5(U$5:VSS_130_2E5) U1.2E6(U$5:VSS_131_2E6) U1.2E8(U$5:VSS_132_2E8) U1.2E9(U$5:VSS_133_2E9) U1.2E10(U$5:AVSS1_24_2E10) U1.2E11(U$5:PCIE1_SATA1_USB3_OTG1_AVDD0V85_2E11) U1.2E12(U$5:PCIE1_SATA1_USB3_OTG1_AVDD1V8_2E12) U1.2F4(U$5:VSS_134_2F4) U1.2F5(U$5:VSS_135_2F5) U1.2F6(U$5:VSS_136_2F6) U1.2F11(U$5:PCIE0_SATA0_AVDD0V85_2F11) U1.2F12(U$5:PCIE0_SATA0_AVDD1V8_2F12) U1.2G4(U$5:VSS_137_2G4) U1.2G7(U$5:VSS_138_2G7) U1.2G10(U$5:VSS_139_2G10) U1.2G12(U$5:PLL_AVSS_2G12) U1.2H3(U$5:VSS_140_2H3) U1.2H5(U$5:VSS_141_2H5) U1.2H10(U$5:TVSS_2H10) U1.2J1(U$5:VSS_142_2J1) U1.2J5(U$5:VSS_143_2J5) U1.2J8(U$5:VSS_144_2J8) U1.2J11(U$5:VSS_145_2J11) U1.2J12(U$5:VSS_146_2J12) U1.2K1(U$6:VSS_147_2K1) U1.2K2(U$6:VSS_148_2K2) U1.2K5(U$6:VSS_149_2K5) U1.2K8(U$6:VSS_150_2K8) U1.2K9(U$6:VSS_151_2K9) U1.2K10(U$6:VSS_152_2K10) U1.2K12(U$6:VSS_153_2K12) U1.2L1(U$6:VSS_154_2L1) U1.2L3(U$6:VSS_155_2L3) U1.2L4(U$6:VSS_156_2L4) U1.2L5(U$6:VSS_157_2L5) U1.2L6(U$6:VSS_158_2L6) U1.2L7(U$6:VSS_159_2L7) U1.2L8(U$6:VSS_160_2L8) U1.2L9(U$6:VSS_161_2L9) U1.2L11(U$6:MIPI_DPHY_CSI1_2_RX_AVDD0V7_2L11) U1.2L12(U$6:VSS_162_2L12) U1.2M1(U$6:AVSS_26_2M1) U1.2M4(U$6:AVSS_27_2M4) U1.2M6(U$6:AVSS_28_2M6) U1.2M9(U$6:AVSS_29_2M9) U1.2M10(U$6:AVSS_30_2M10) U1.2M11(U$6:AVSS_31_2M11) U1.2M12(U$6:AVSS_32_2M12) U1.2N1(U$6:AVSS_33_2N1) U1.2N6(U$6:AVSS_34_2N6) U1.2N8(U$6:AVSS_35_2N8) U1.2N9(U$6:AVSS_36_2N9) U1.2N10(U$6:HDMI_TX_EDP_TX_AVDDIO1V8_2N10) U1.2N11(U$6:HDMI_TX_EDP_TX_AVDDD0V75_2N11) U1.2N12(U$6:AVSS_37_2N12) U1.2P1(U$6:AVSS_38_2P1) U1.2P6(U$6:AVSS_39_2P6) U1.2P9(U$6:AVSS_40_2P9) U1.2P10(U$6:HDMI_TX_EDP_TX_AVDDCMN1V8_2P10) U1.2P11(U$6:HDMI_TX_EDP_TX_AVDDC0V75_2P11) U1.2P12(U$6:AVSS_41_2P12) U1.2R1(U$6:AVSS_42_2R1) U1.2R4(U$6:AVSS_43_2R4) U1.2R5(U$6:AVSS_44_2R5) U1.2R7(U$6:AVSS_45_2R7) U1.2R8(U$6:AVSS_46_2R8) U1.2R9(U$6:AVSS_47_2R9) U1.2R10(U$6:AVSS_48_2R10) U1.2R11(U$6:AVSS_49_2R11) U1.2R12(U$6:AVSS_50_2R12) U1.2T1(U$6:AVSS_51_2T1) U1.2T6(U$6:AVSS_52_2T6) U1.2T8(U$6:AVSS_53_2T8) U1.2T11(U$6:AVSS_54_2T11) U1.2U1(U$6:AVSS_55_2U1) U1.2U2(U$6:AVSS_56_2U2) U1.2U3(U$6:AVSS_57_2U3) U1.2U4(U$6:AVSS_58_2U4) U1.2U5(U$6:AVSS_59_2U5) U1.2U6(U$6:AVSS_60_2U6) U1.2U7(U$6:AVSS_61_2U7) U1.2U9(U$6:AVSS_62_2U9) U1.2U10(U$6:AVSS_63_2U10) U1.2U11(U$6:AVSS_64_2U11) U1.2V1(U$6:AVSS_65_2V1) U1.2V2(U$6:AVSS_66_2V2) U1.2V3(U$6:AVSS_67_2V3) U1.2V4(U$6:AVSS_68_2V4) U1.2V5(U$6:AVSS_69_2V5) U1.2V6(U$6:AVSS_70_2V6) U1.2V7(U$6:AVSS_71_2V7) U1.2V8(U$6:AVSS_72_2V8) U1.2V9(U$6:AVSS_73_2V9) U1.2V10(U$6:AVSS_74_2V10) U1.2V11(U$6:AVSS_75_2V11) U1.2V12(U$6:AVSS_76_2V12) ; also sheet 1,2,3,5
MIPI_DCPHY_AVDD: C1504.1 C1505.1 PWR323.MIPI_DCPHY_AVDD PWR325.MIPI_DCPHY_AVDD R1502.2 U1.2M7(U$6:MIPI_DCPHY_AVDD_2M7)
MIPI_DCPHY_VREG: C1503.1 U1.2N7(U$6:MIPI_DCPHY_VREG_2N7)
OSC_1V8: U1.2J10(U$5:OSC_AVDD1V8_2J10) ; also sheet 5
SARADC_AVDD1V8: U1.2A10(U$5:SARADC_AVDD1V8_2A10) ; also sheet 5
UFS_AVDD0V85: C1302.1 C1303.1 R1320.2 U1.2N2(U$6:UFS_AVDD0V85_2N2)
UFS_AVDD1V8: C1305.1 C1306.1 R1323.2 U1.2P2(U$6:UFS_AVDD1V8_2P2)
USB2_OTG0_REXT: R1401.1 U1.2R3(U$6:USB2_OTG0_REXT_2R3)
USB2_OTG0_VBUSDET: U1.2P3(U$6:USB2_OTG0_VBUSDET_2P3) ; also sheet 1
USB2_OTG1_REXT: R1402.1 U1.2U8(U$6:USB2_OTG1_REXT_2U8)
VCC_1V8_S0: C1300.1 C1308.1 C1903.1 PWR336.VCC_1V8_S0 PWR338.VCC_1V8_S0 U1.2A2(U$5:VCCIO2_VCC_2A2) U1.2A4(U$5:VCCIO5_VCC_0_2A4) U1.2A5(U$5:VCCIO5_VCC_1_2A5) U1.2M3(U$6:VCCIO7_VCC_2M3) ; also sheet 3,5
VCC_1V8_S3: C1103.1 PWR330.VCC_1V8_S3 R2427.1 U1.2K11(U$6:PMUIO0_VCC1V8_2K11) ; also sheet 2,3,5
VCC_3V3_S0: C1408.1 C1802.1 C1901.1 PWR342.VCC_3V3_S0 PWR344.VCC_3V3_S0 PWR346.VCC_3V3_S0 U1.2A7(U$5:VCCIO4_VCC_2A7) U1.2N3(U$6:VCCIO6_VCC_2N3) U1.2P7(U$6:USB2_OTG_AVDD3V3_2P7) ; also sheet 3
VCC_3V3_S3: C1106.1 PWR332.VCC_3V3_S3 ; also sheet 2,3,5
VCCA_1V8_S0: C1105.1 C1402.1 C1403.1 C1406.1 C1509.1 PWR317.VCCA_1V8_S0 PWR319.VCCA_1V8_S0 PWR321.VCCA_1V8_S0 R1202.1 R1323.1 U1.2H12(U$5:PLL_AVDD1V8_2H12) U1.2M2(U$6:OSC_UFS_AVDD_2M2) U1.2N4(U$6:USB3_OTG0_DP_TX_AVDD1V8_2N4) U1.2P4(U$6:USB2_OTG_AVDD1V8_2P4) U1.2P8(U$6:MIPI_DCPHY_AVDD1V8_2P8) ; also sheet 2,3,5
VCCIO_SD_S0: C1309.1 PWR340.VCCIO_SD_S0 U1.2A8(U$5:VCCIO1_VCC_2A8) ; also sheet 2
VCCIO_WL: C1801.1 C2423.1 R2427.2 U1.2B10(U$5:VCCIO3_VCC_2B10)
VDD_0V75_S3: C1107.1 C1118.1 PWR307.VDD_0V75_S3 PWR309.VDD_0V75_S3 U1.2L2(U$6:PMU_LOGIC_DVDD0V75_0_2L2) U1.2L10(U$6:PMU_LOGIC_DVDD0V75_1_2L10) ; also sheet 2
VDD_CPU_BIG_S0: C1000.1 C1001.1 C1002.1 C1003.1 C1004.1 C1005.1 C1006.1 C1007.1 PWR205.VDD_CPU_BIG_S0 PWR207.VDD_CPU_BIG_S0 PWR209.VDD_CPU_BIG_S0 PWR211.VDD_CPU_BIG_S0 PWR213.VDD_CPU_BIG_S0 PWR215.VDD_CPU_BIG_S0 PWR217.VDD_CPU_BIG_S0 PWR219.VDD_CPU_BIG_S0 U1.2G5(U$5:CPU_BIG_DVDD_0_2G5) U1.2G6(U$5:CPU_BIG_DVDD_1_2G6) U1.2H6(U$5:CPU_BIG_DVDD_2_2H6) U1.2H7(U$5:CPU_BIG_DVDD_3_2H7) U1.2J6(U$5:CPU_BIG_DVDD_4_2J6) U1.2J7(U$5:CPU_BIG_DVDD_5_2J7) U1.2K6(U$6:CPU_BIG_DVDD_6_2K6) U1.2K7(U$6:CPU_BIG_DVDD_7_2K7) ; also sheet 2
VDD_CPU_LIT_S0: C1009.1 C1010.1 C1011.1 C1012.1 C1013.1 PWR221.VDD_CPU_LIT_S0 PWR223.VDD_CPU_LIT_S0 PWR225.VDD_CPU_LIT_S0 PWR227.VDD_CPU_LIT_S0 PWR229.VDD_CPU_LIT_S0 U1.2H4(U$5:CPU_LIT_DVDD_0_2H4) U1.2J3(U$5:CPU_LIT_DVDD_1_2J3) U1.2J4(U$5:CPU_LIT_DVDD_2_2J4) U1.2K3(U$6:CPU_LIT_DVDD_3_2K3) U1.2K4(U$6:CPU_LIT_DVDD_4_2K4) ; also sheet 2
VDD_DDR_S0: C1206.1 C1207.1 C1208.1 C1209.1 C1210.1 C1211.1 PWR289.VDD_DDR_S0 PWR291.VDD_DDR_S0 PWR293.VDD_DDR_S0 PWR295.VDD_DDR_S0 PWR297.VDD_DDR_S0 PWR299.VDD_DDR_S0 U1.2E2(U$5:DDRPHY_DVDD_0_2E2) U1.2F3(U$5:DDRPHY_DVDD_1_2F3) U1.2G2(U$5:DDRPHY_DVDD_2_2G2) U1.2G3(U$5:DDRPHY_DVDD_3_2G3) U1.2H2(U$5:DDRPHY_DVDD_4_2H2) ; also sheet 2
VDD_GPU_S0: C1026.1 C1027.1 C1028.1 C1029.1 C1030.1 C1031.1 C1039.1 PWR247.VDD_GPU_S0 PWR249.VDD_GPU_S0 PWR251.VDD_GPU_S0 PWR253.VDD_GPU_S0 PWR255.VDD_GPU_S0 PWR257.VDD_GPU_S0 PWR259.VDD_GPU_S0 U1.2C4(U$5:GPU_DVDD_0_2C4) U1.2C5(U$5:GPU_DVDD_1_2C5) U1.2D4(U$5:GPU_DVDD_2_2D4) U1.2D5(U$5:GPU_DVDD_3_2D5) U1.2E4(U$5:GPU_DVDD_4_2E4) ; also sheet 2
VDD_LOGIC_S0: C1015.1 C1016.1 C1017.1 C1018.1 C1020.1 C1021.1 C1023.1 C1024.1 PWR231.VDD_LOGIC_S0 PWR233.VDD_LOGIC_S0 PWR235.VDD_LOGIC_S0 PWR237.VDD_LOGIC_S0 PWR239.VDD_LOGIC_S0 PWR241.VDD_LOGIC_S0 PWR243.VDD_LOGIC_S0 PWR245.VDD_LOGIC_S0 U1.2E7(U$5:LOGIC_DVDD_0_2E7) U1.2F7(U$5:LOGIC_MEM_DVDD_0_2F7) U1.2F8(U$5:LOGIC_DVDD_1_2F8) U1.2F9(U$5:LOGIC_DVDD_2_2F9) U1.2G8(U$5:LOGIC_DVDD_3_2G8) U1.2G9(U$5:LOGIC_DVDD_4_2G9) U1.2H8(U$5:LOGIC_DVDD_5_2H8) U1.2H9(U$5:LOGIC_DVDD_6_2H9) U1.2J9(U$5:LOGIC_MEM_DVDD_1_2J9) ; also sheet 2
VDD_NPU_S0: C1032.1 C1033.1 C1034.1 C1035.1 C1036.1 C1037.1 C1038.1 C1040.1 PWR261.VDD_NPU_S0 PWR263.VDD_NPU_S0 PWR265.VDD_NPU_S0 PWR267.VDD_NPU_S0 PWR269.VDD_NPU_S0 PWR271.VDD_NPU_S0 PWR273.VDD_NPU_S0 PWR275.VDD_NPU_S0 U1.2C7(U$5:NPU_DVDD_0_2C7) U1.2C8(U$5:NPU_DVDD_1_2C8) U1.2C9(U$5:NPU_DVDD_2_2C9) U1.2D7(U$5:NPU_DVDD_3_2D7) U1.2D8(U$5:NPU_DVDD_4_2D8) ; also sheet 2
VDDA_0V75_S0: C1104.1 C1117.1 C1405.1 PWR311.VDDA_0V75_S0 PWR313.VDDA_0V75_S0 PWR315.VDDA_0V75_S0 R1502.1 U1.2G11(U$5:PLL_DVDD0V75_2G11) U1.2H11(U$5:OTP_DVDD0V75_2H11) U1.2P5(U$6:USB2_OTG_DVDD0V75_2P5) ; also sheet 2
VDDA_0V85_S0: C1400.1 C1401.1 R1320.1 U1.2M5(U$6:USB3_OTG0_DP_TX_AVDD0V85_2M5) U1.2N5(U$6:USB3_OTG0_DP_TX_DVDD0V85_2N5) ; also sheet 2
VDDA_1V2_S0: C1506.1 PWR328.VDDA_1V2_S0 U1.2M8(U$6:MIPI_DCPHY_AVDD1V2_2M8) ; also sheet 2
VDDA_DDR_PLL_S0: C1212.1 PWR303.VDDA_DDR_PLL_S0 U1.2C3(U$5:DDRPHY_PLL_DVDD_2C3) ; also sheet 2
VDDQ_DDR_CKE_S3: C1214.1 U1.2B2(U$5:DDRPHY_CKE_VDDQ_2B2) ; also sheet 2
VDDQ_DDR_S0: C1200.1 C1201.1 C1202.1 C1203.1 C1204.1 C1205.1 PWR277.VDDQ_DDR_S0 PWR279.VDDQ_DDR_S0 PWR281.VDDQ_DDR_S0 PWR283.VDDQ_DDR_S0 PWR285.VDDQ_DDR_S0 PWR287.VDDQ_DDR_S0 U1.2D1(U$5:DDRPHY_CK_VDDQ_2D1) U1.2E1(U$5:DDRPHY_VDDQ_0_2E1) U1.2F1(U$5:DDRPHY_VDDQ_1_2F1) U1.2F2(U$5:DDRPHY_VDDQ_2_2F2) U1.2G1(U$5:DDRPHY_VDDQ_3_2G1) U1.2H1(U$5:DDRPHY_VDDQ_4_2H1) U1.2J2(U$5:DDRPHY_VDDQ_5_2J2) ; also sheet 2
Unconnected: U1.2F10(U$5:TSADC_TEST_OUT_TS_2F10) U1.2R2(U$6:UFS_TX_REXT_2R2) U1.2R6(U$6:USB2_OTG0_ID_2R6) U1.2T2(U$6:DP_TX_AUXP_2T2) U1.2T3(U$6:DP_TX_AUXN_2T3) U1.2T4(U$6:USB2_OTG1_DP_2T4) U1.2T5(U$6:USB2_OTG1_DM_2T5) U1.2T7(U$6:USB3_OTG0_REXT_DP_TX_REXT_2T7) U1.2T9(U$6:USB2_OTG1_ID_2T9) U1.2T10(U$6:USB2_OTG1_VBUSDET_2T10) U1.2T12(U$6:HDMI_TX_SBDP_EDP_TX_AUXP_2T12) U1.2U12(U$6:HDMI_TX_SBDN_EDP_TX_AUXN_2U12)

### Notes on the sheet
- PROJECT FRIDAY — S4: RK3576 (U1) POWER, GROUND, DECOUPLING & UNUSED BLOCKS — EVB P.10-19 & HDG S2 | REV SCH-1 | PRINCIPLE: COPY RK3576 EVB1 V1.2
- EVB sheets 05, 06, 10-19, 23-24; RK3576 DS Table 3-2; HDG sections 2.1.11.1 and 2.2.2. RK3576 FCCSP-698L footprint: UNVERIFIED vs DS section 2.